# Altium schematic sheet UC3842.SchDoc (part 1 of 2)
size 1651 x 1651 mm; SheetNumber: 1; SheetTotal: 1
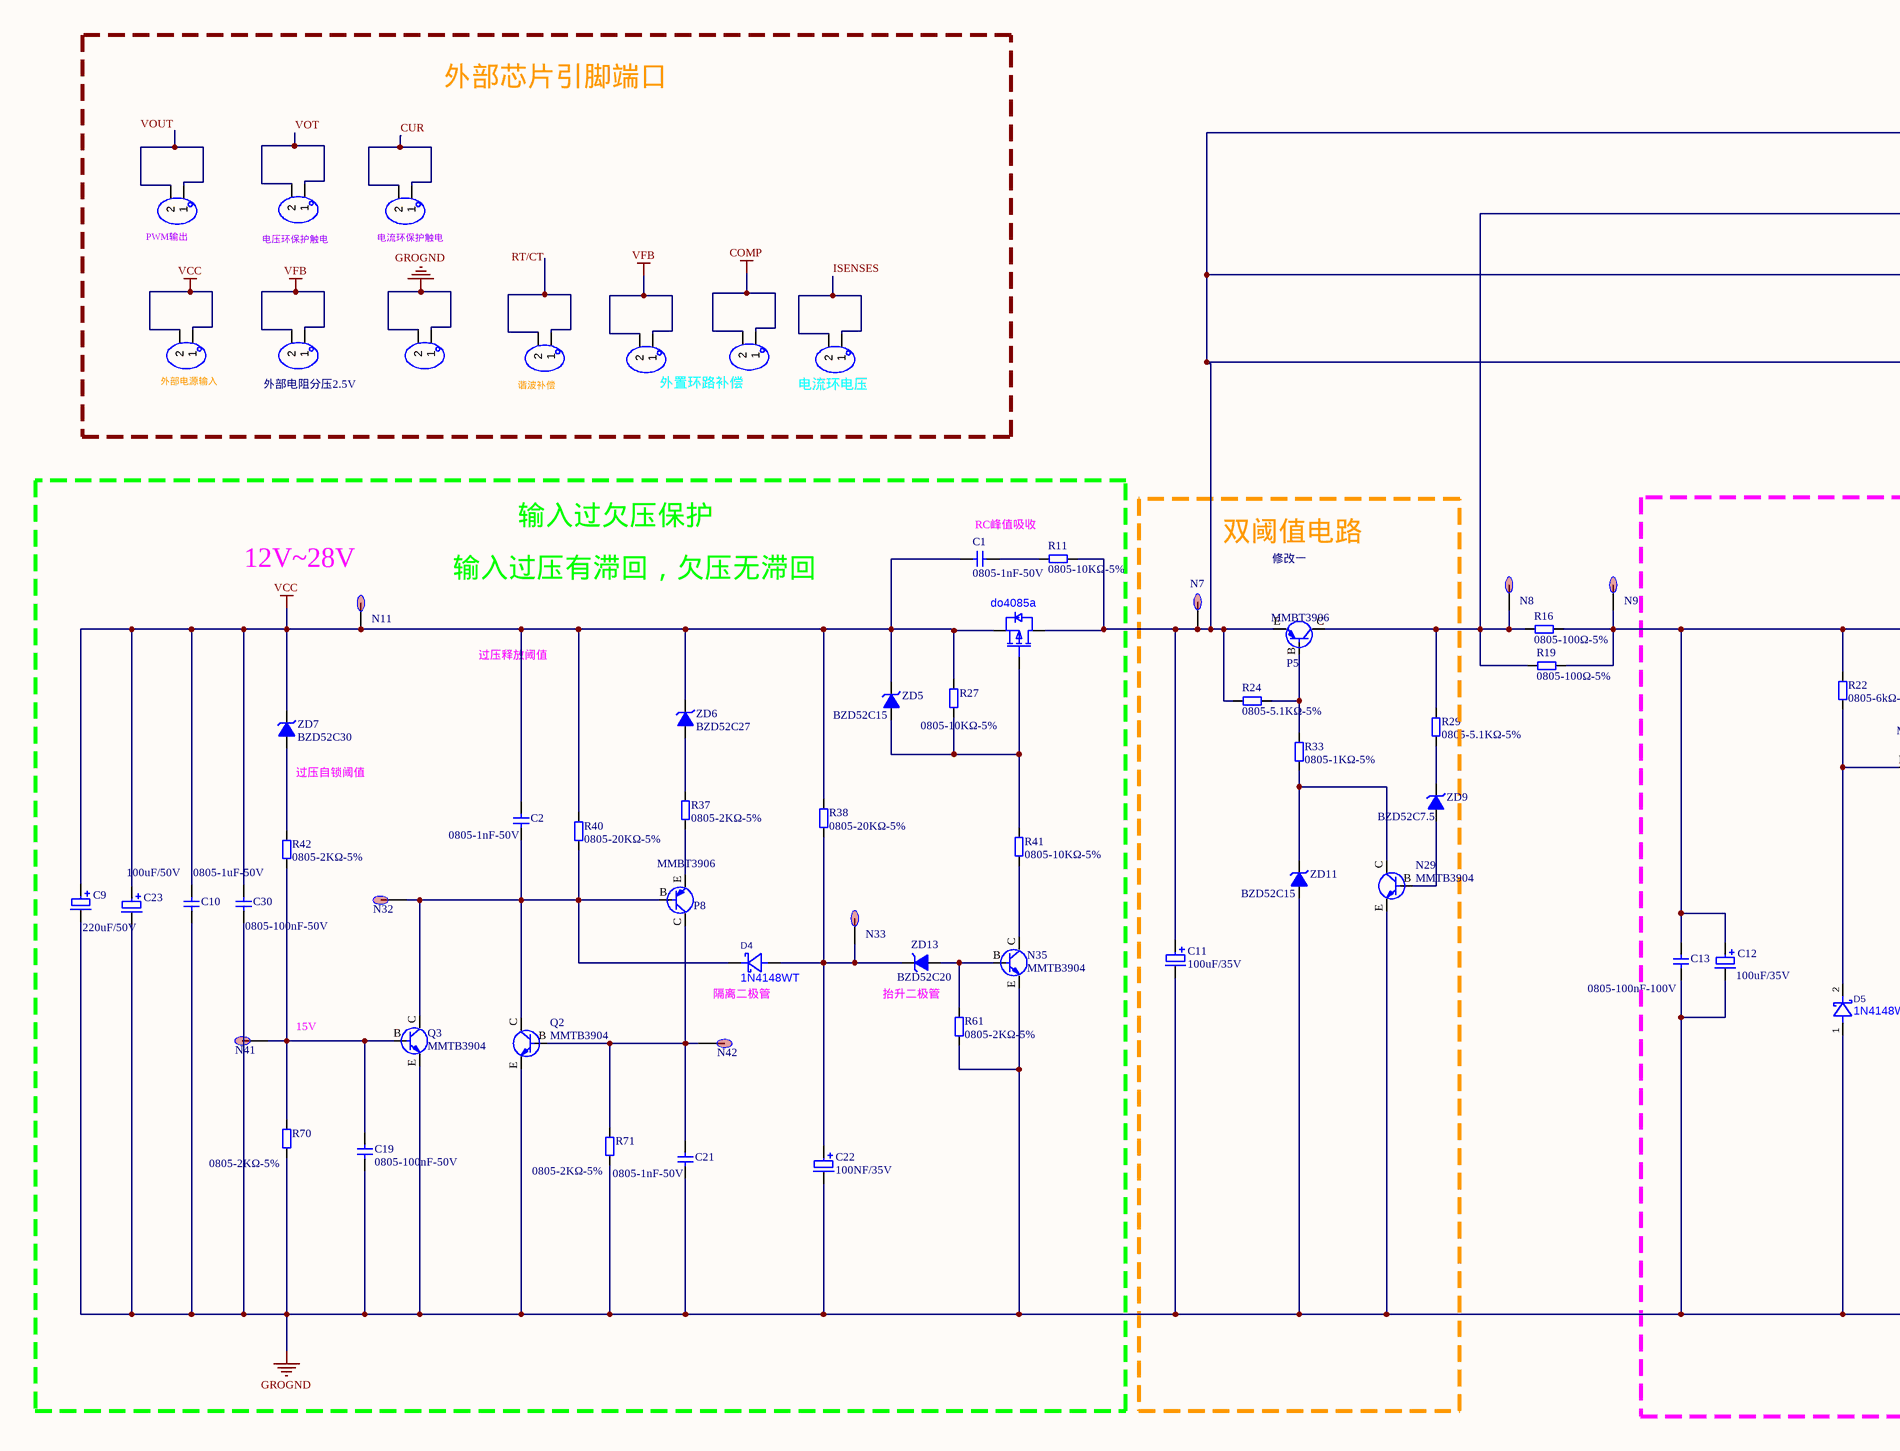
[diagram p0: UC3842.SchDoc, top column 1 of 4]
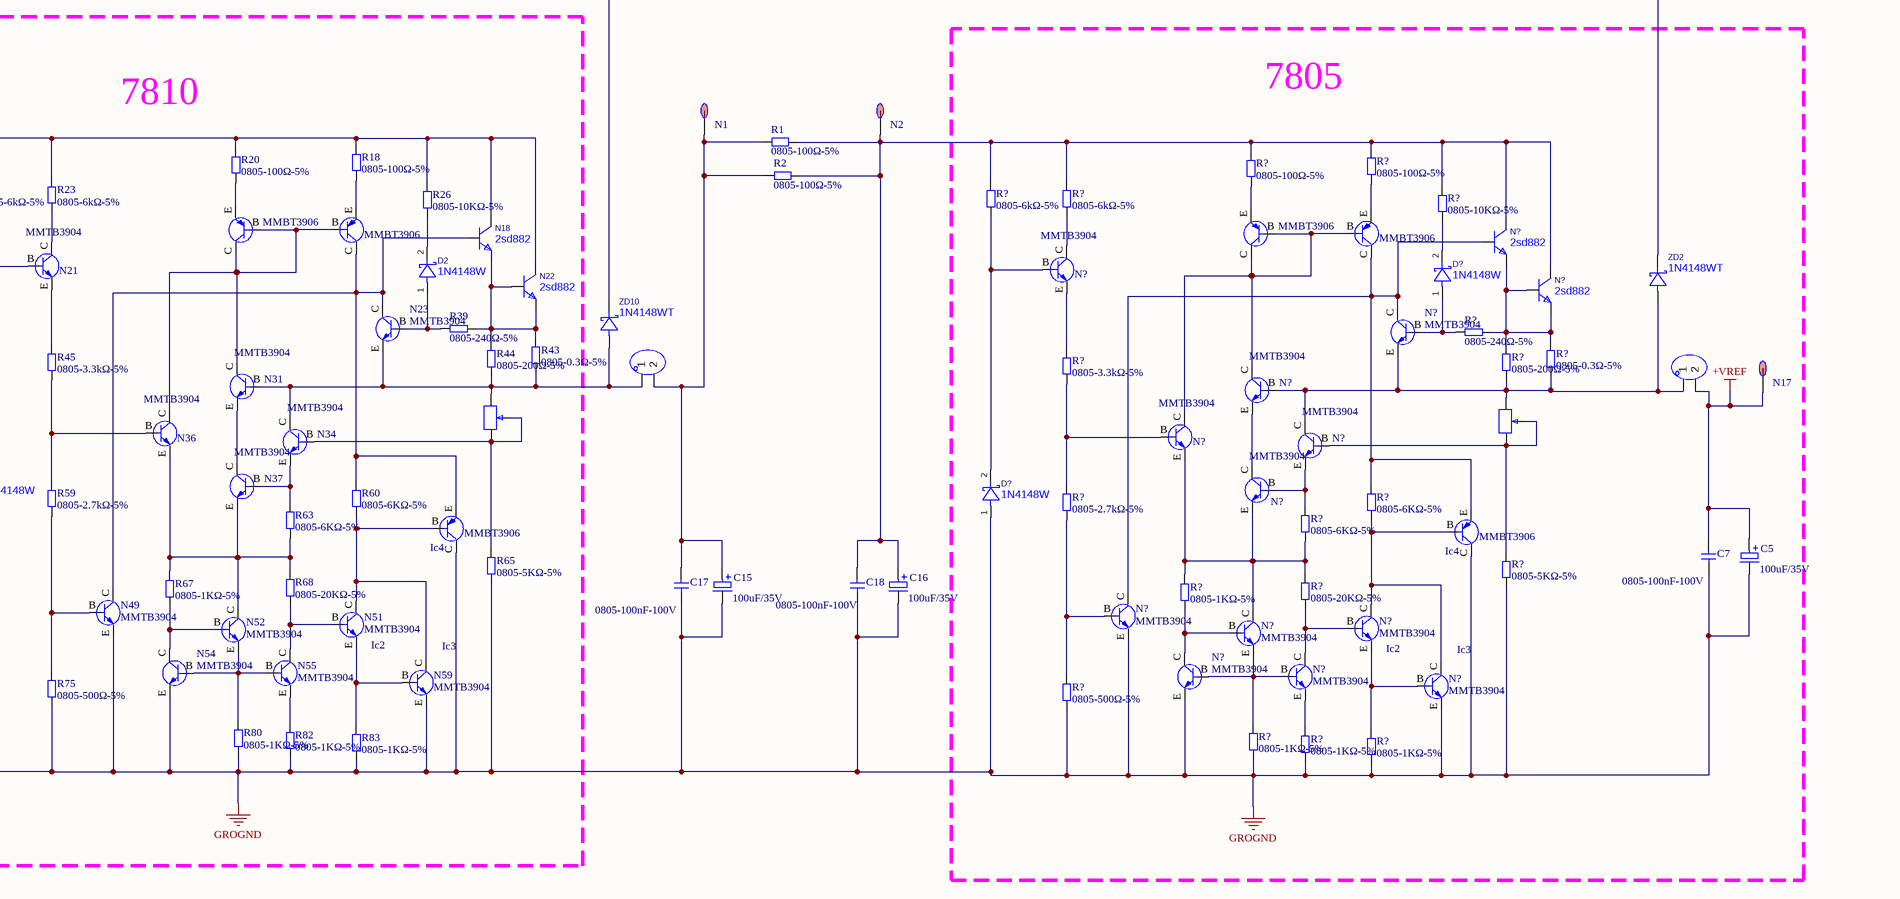
[diagram p1: UC3842.SchDoc, top column 2 of 4]
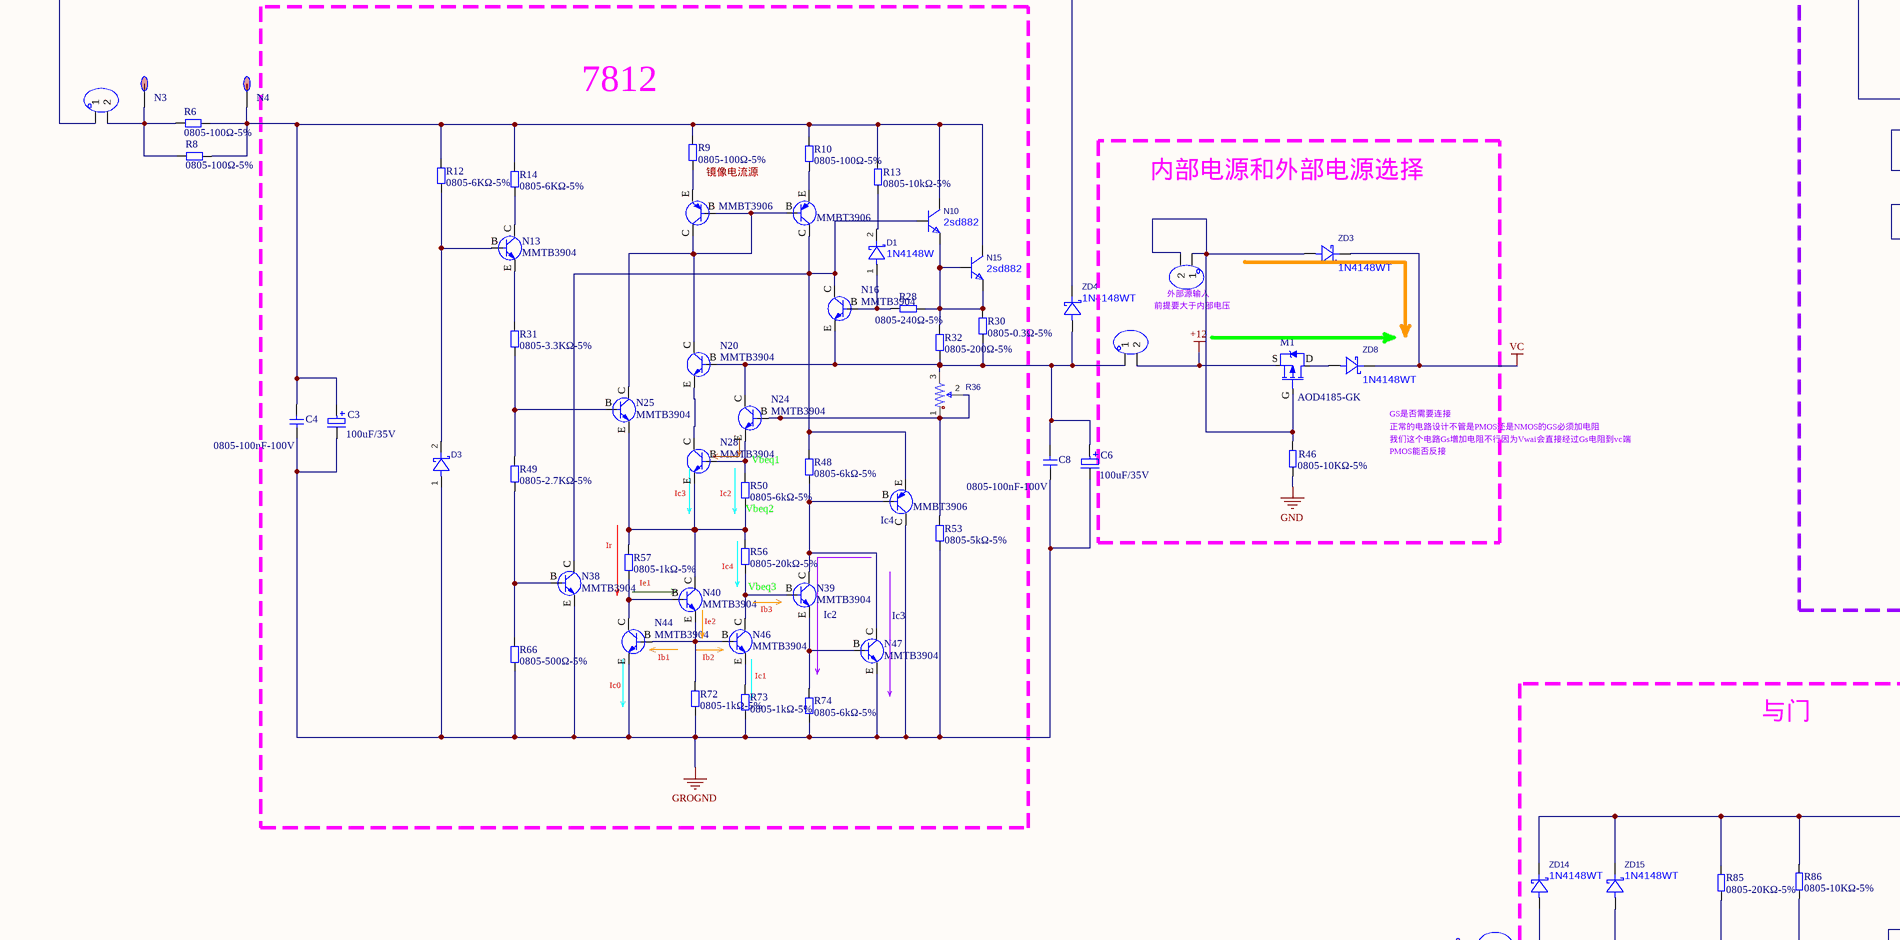
[diagram p2: UC3842.SchDoc, top column 3 of 4]
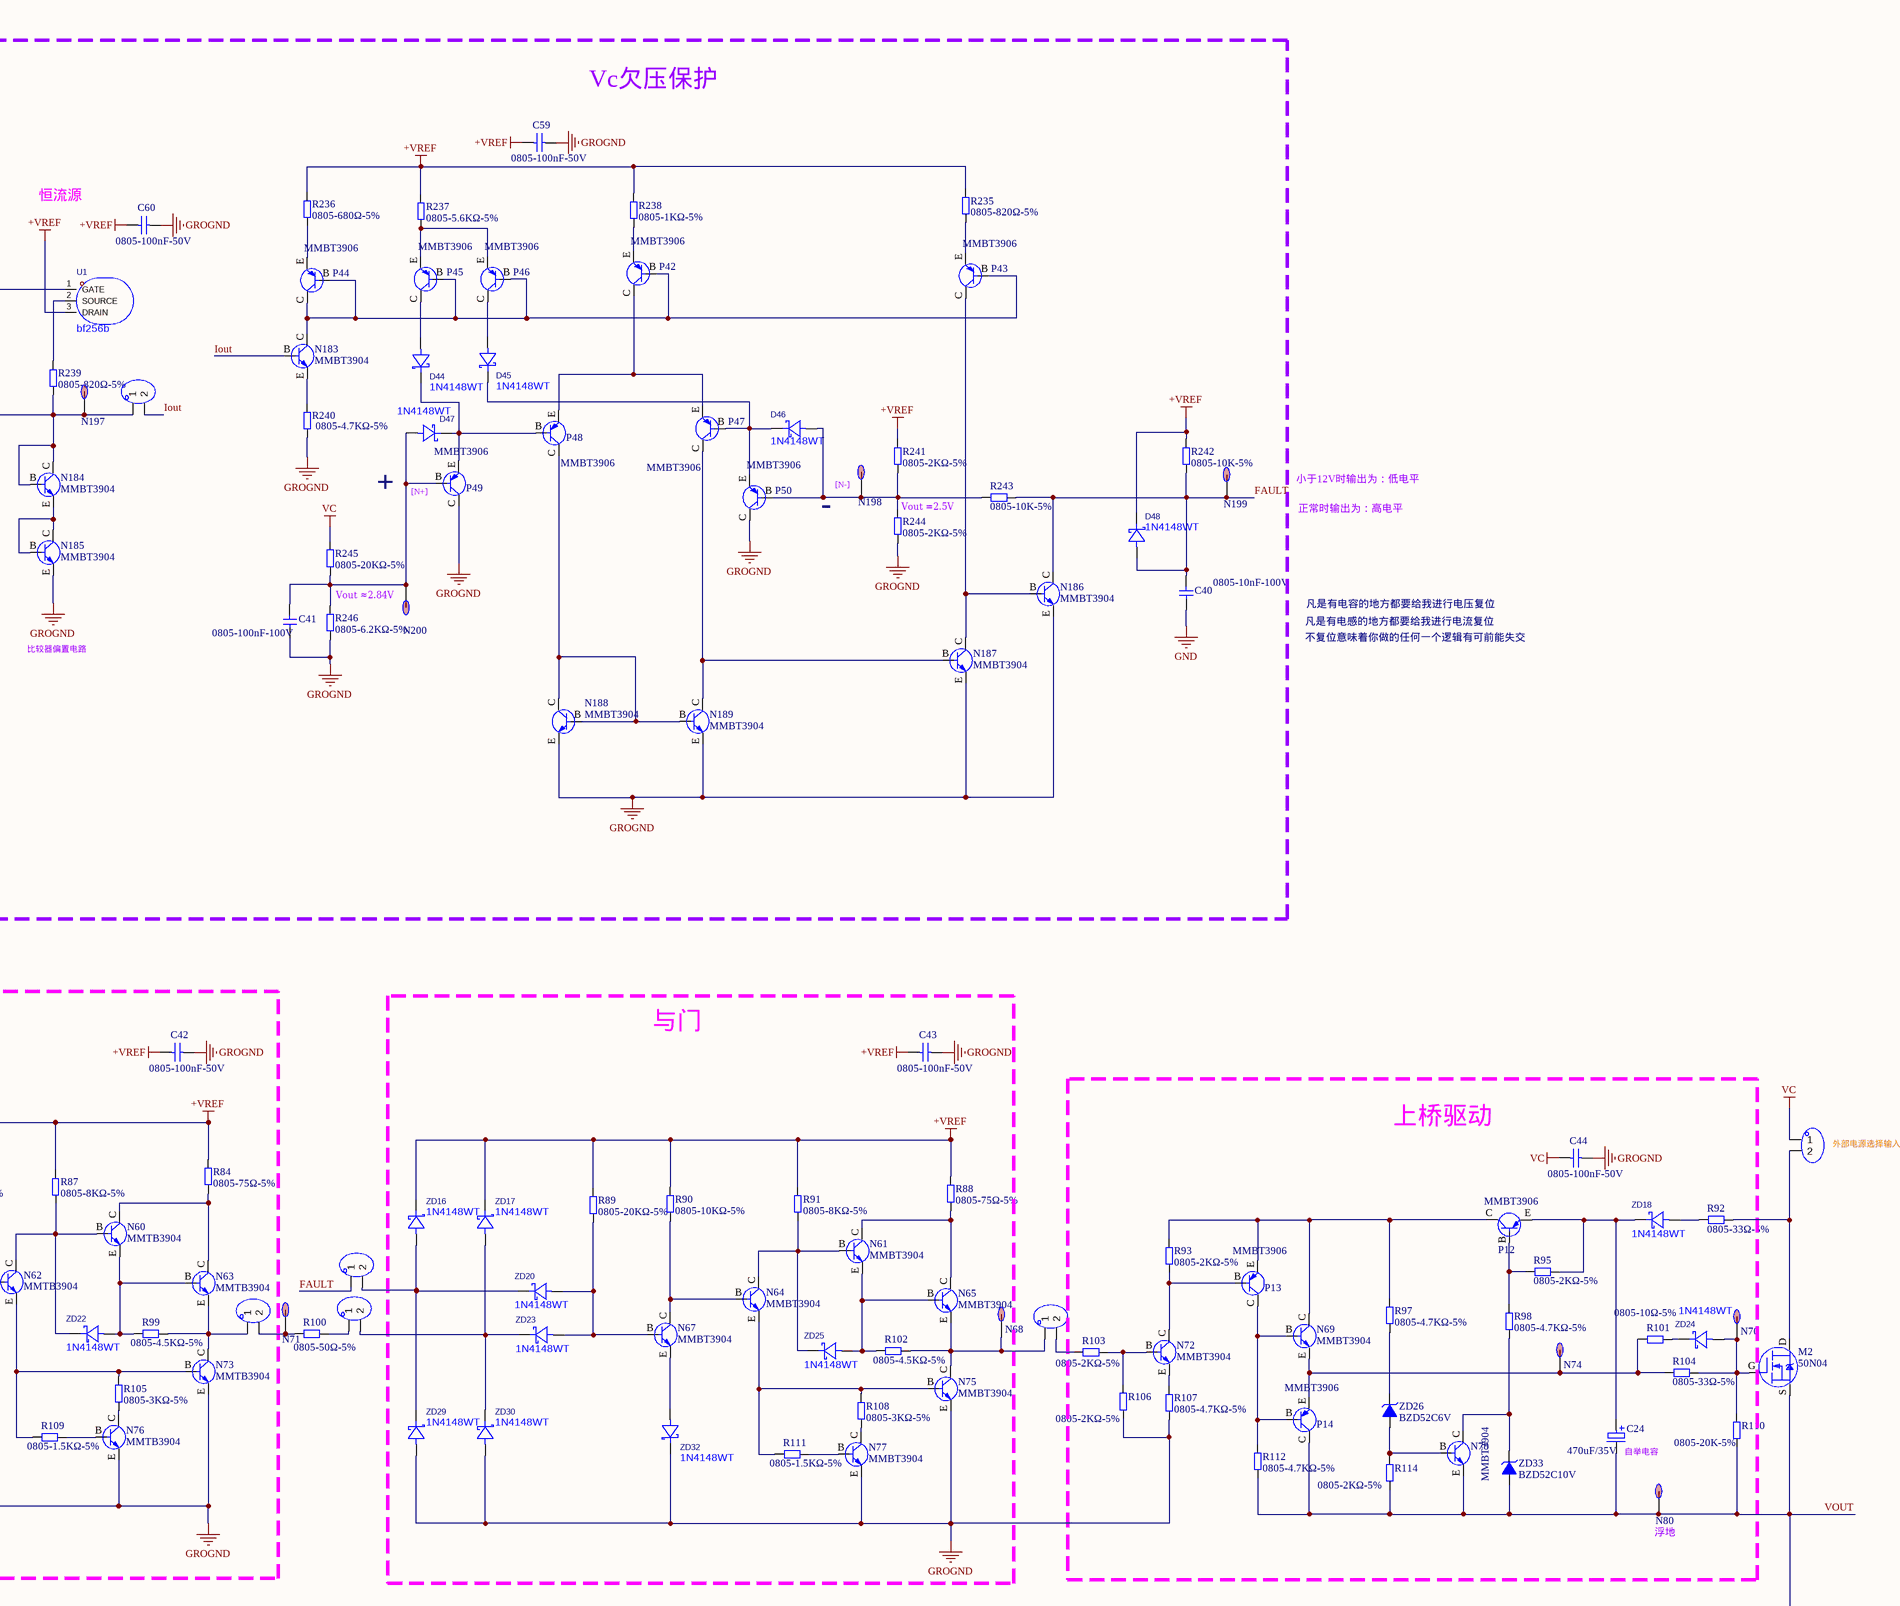
[diagram p3: UC3842.SchDoc, top column 4 of 4]
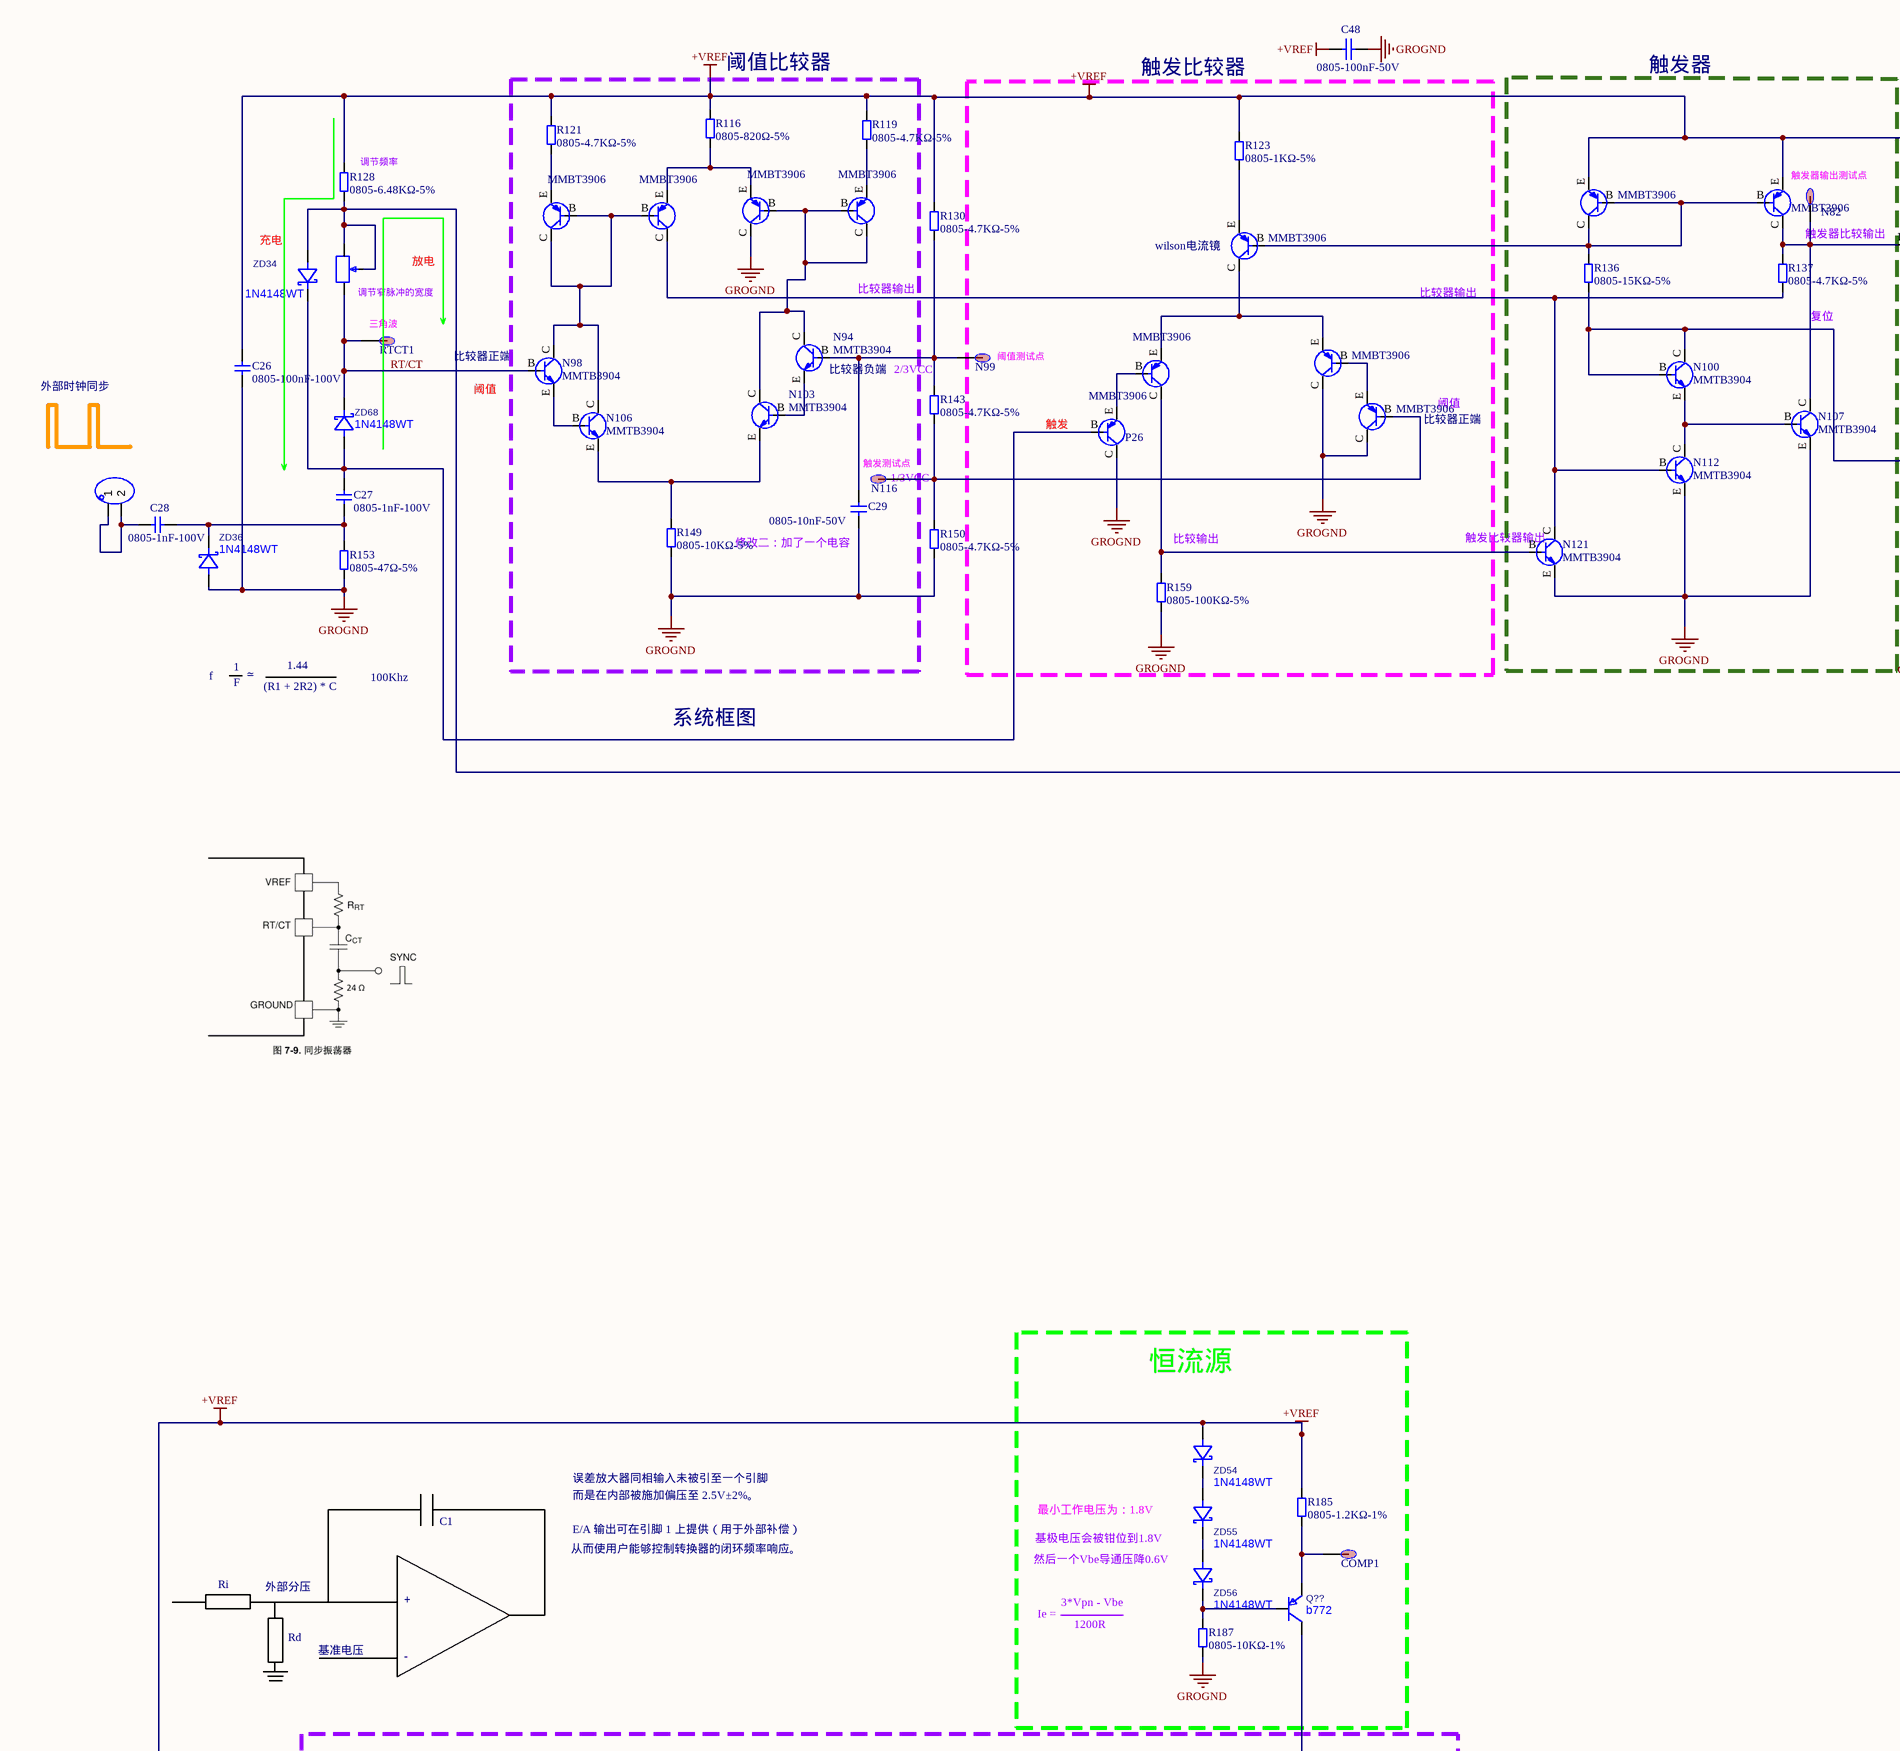
[diagram p4: UC3842.SchDoc, centre column 1 of 4]
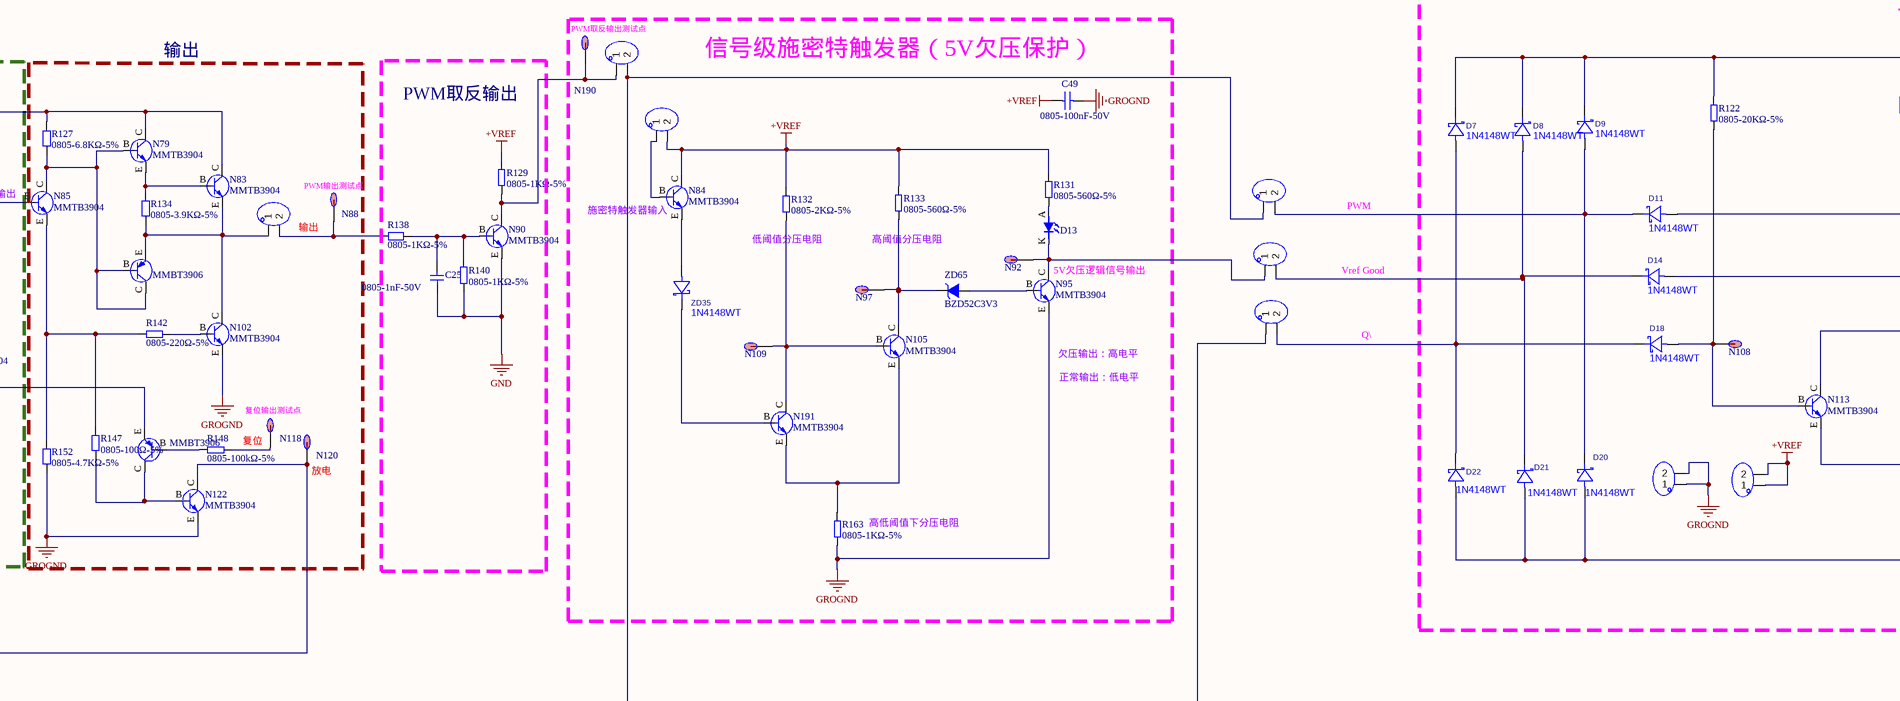
[diagram p5: UC3842.SchDoc, centre column 2 of 4]
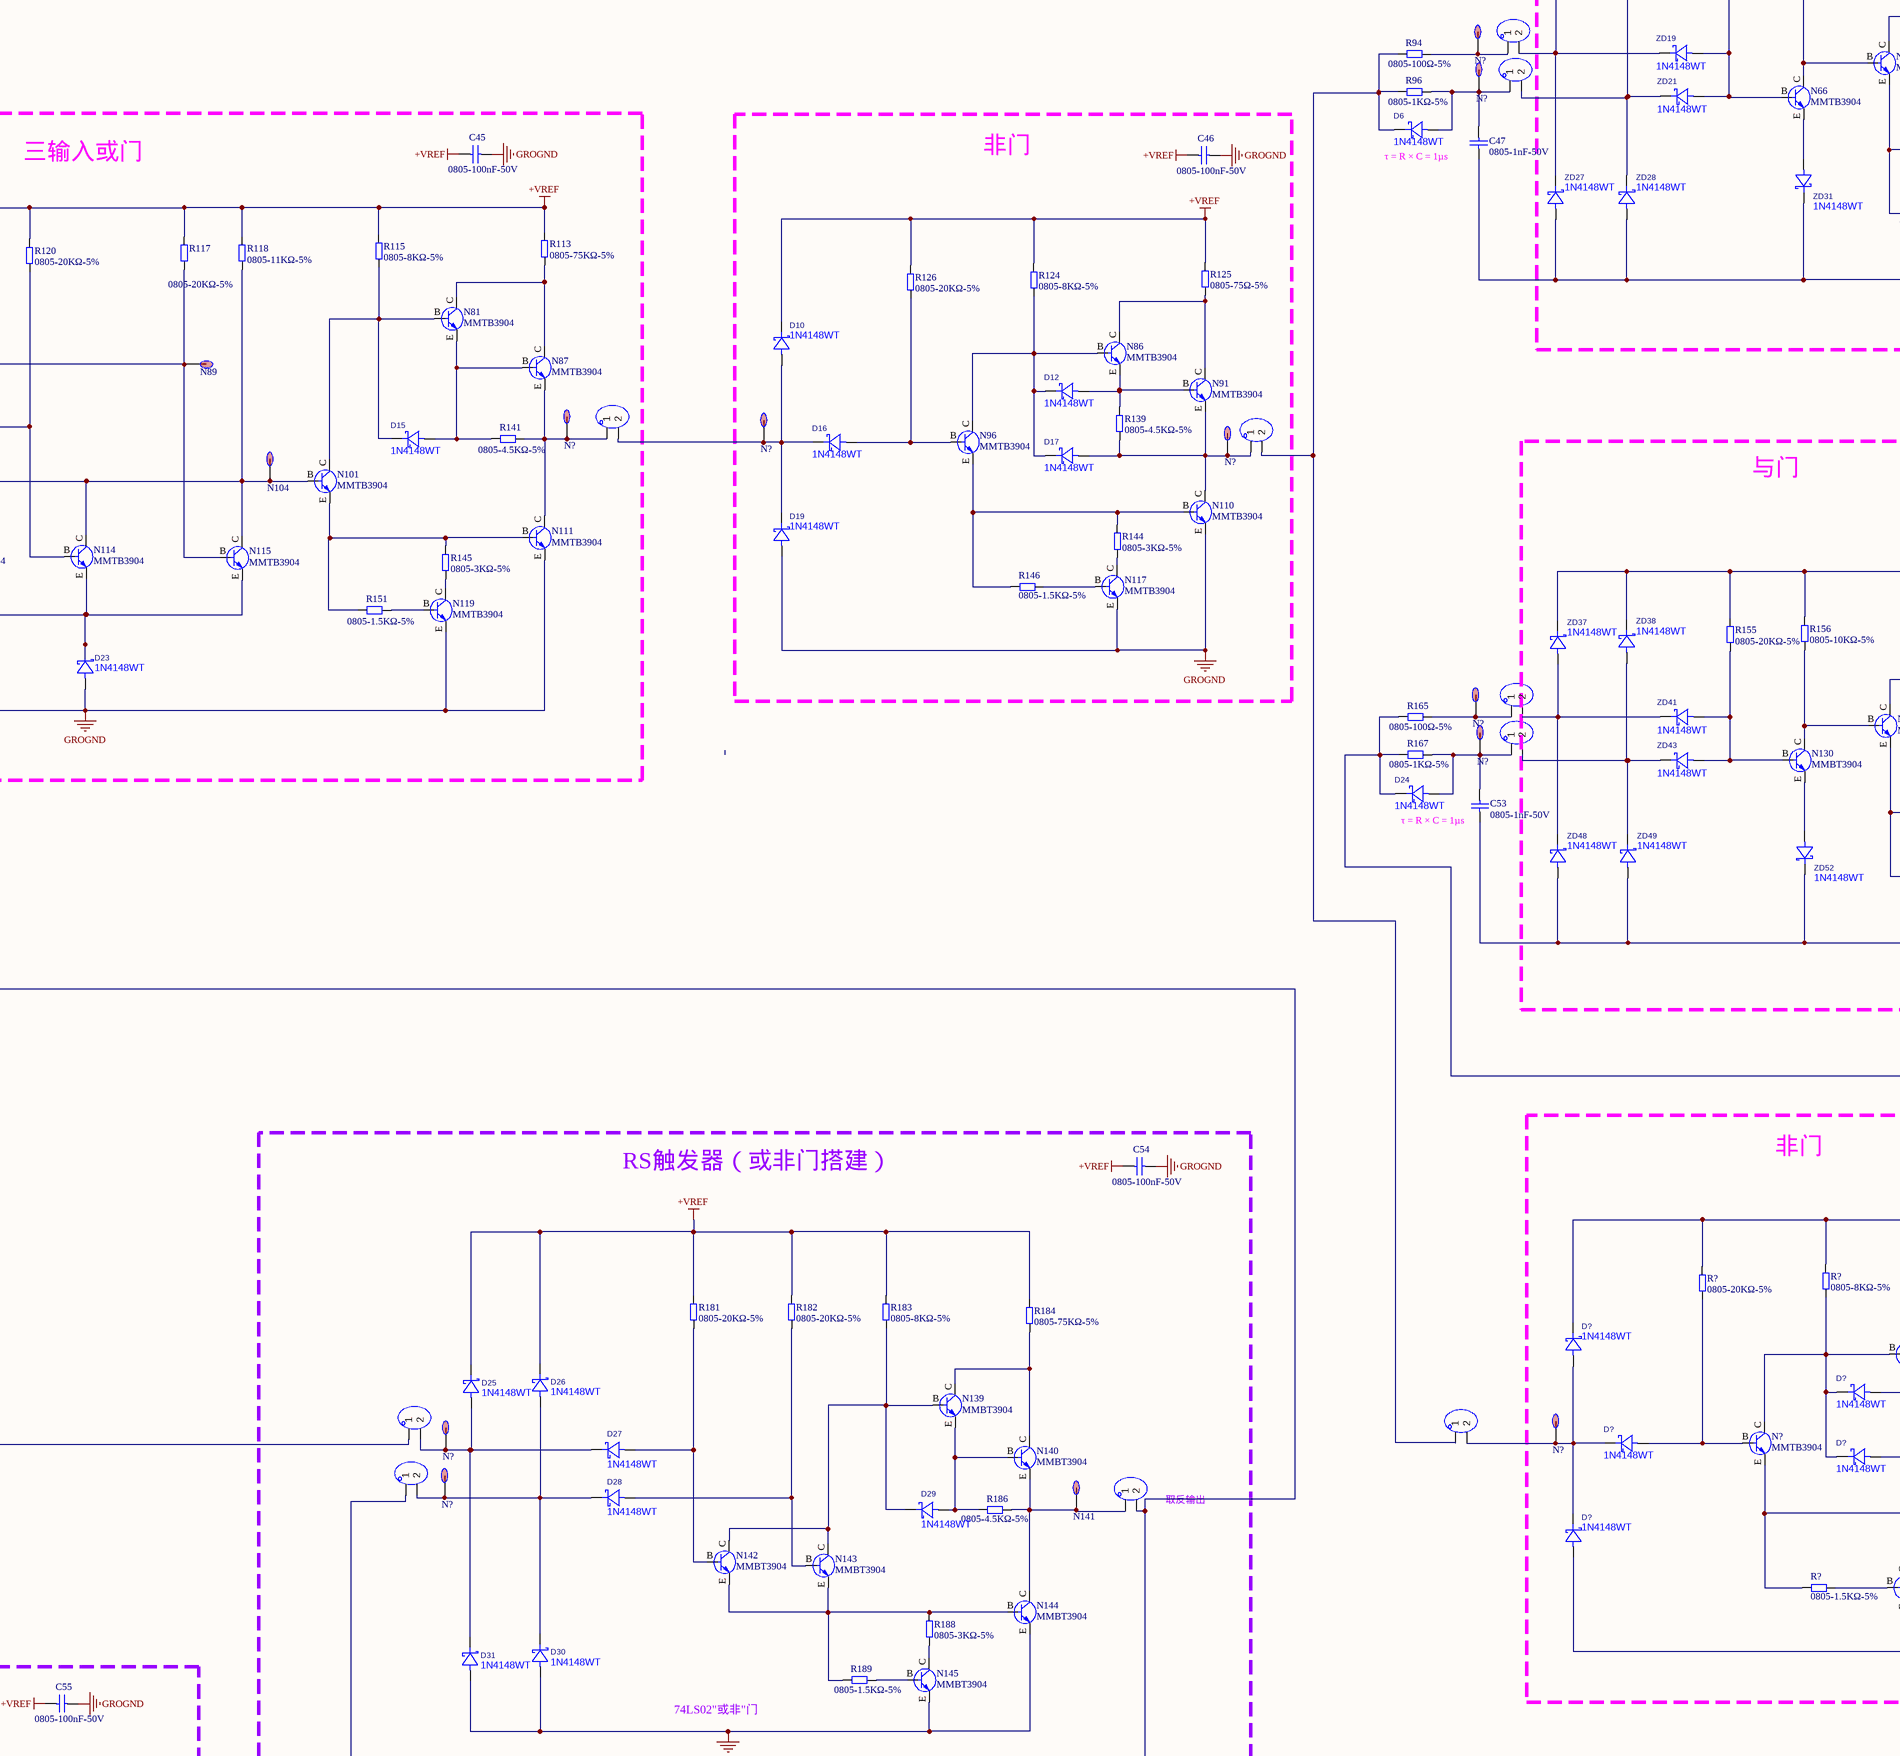
[diagram p6: UC3842.SchDoc, centre column 3 of 4]
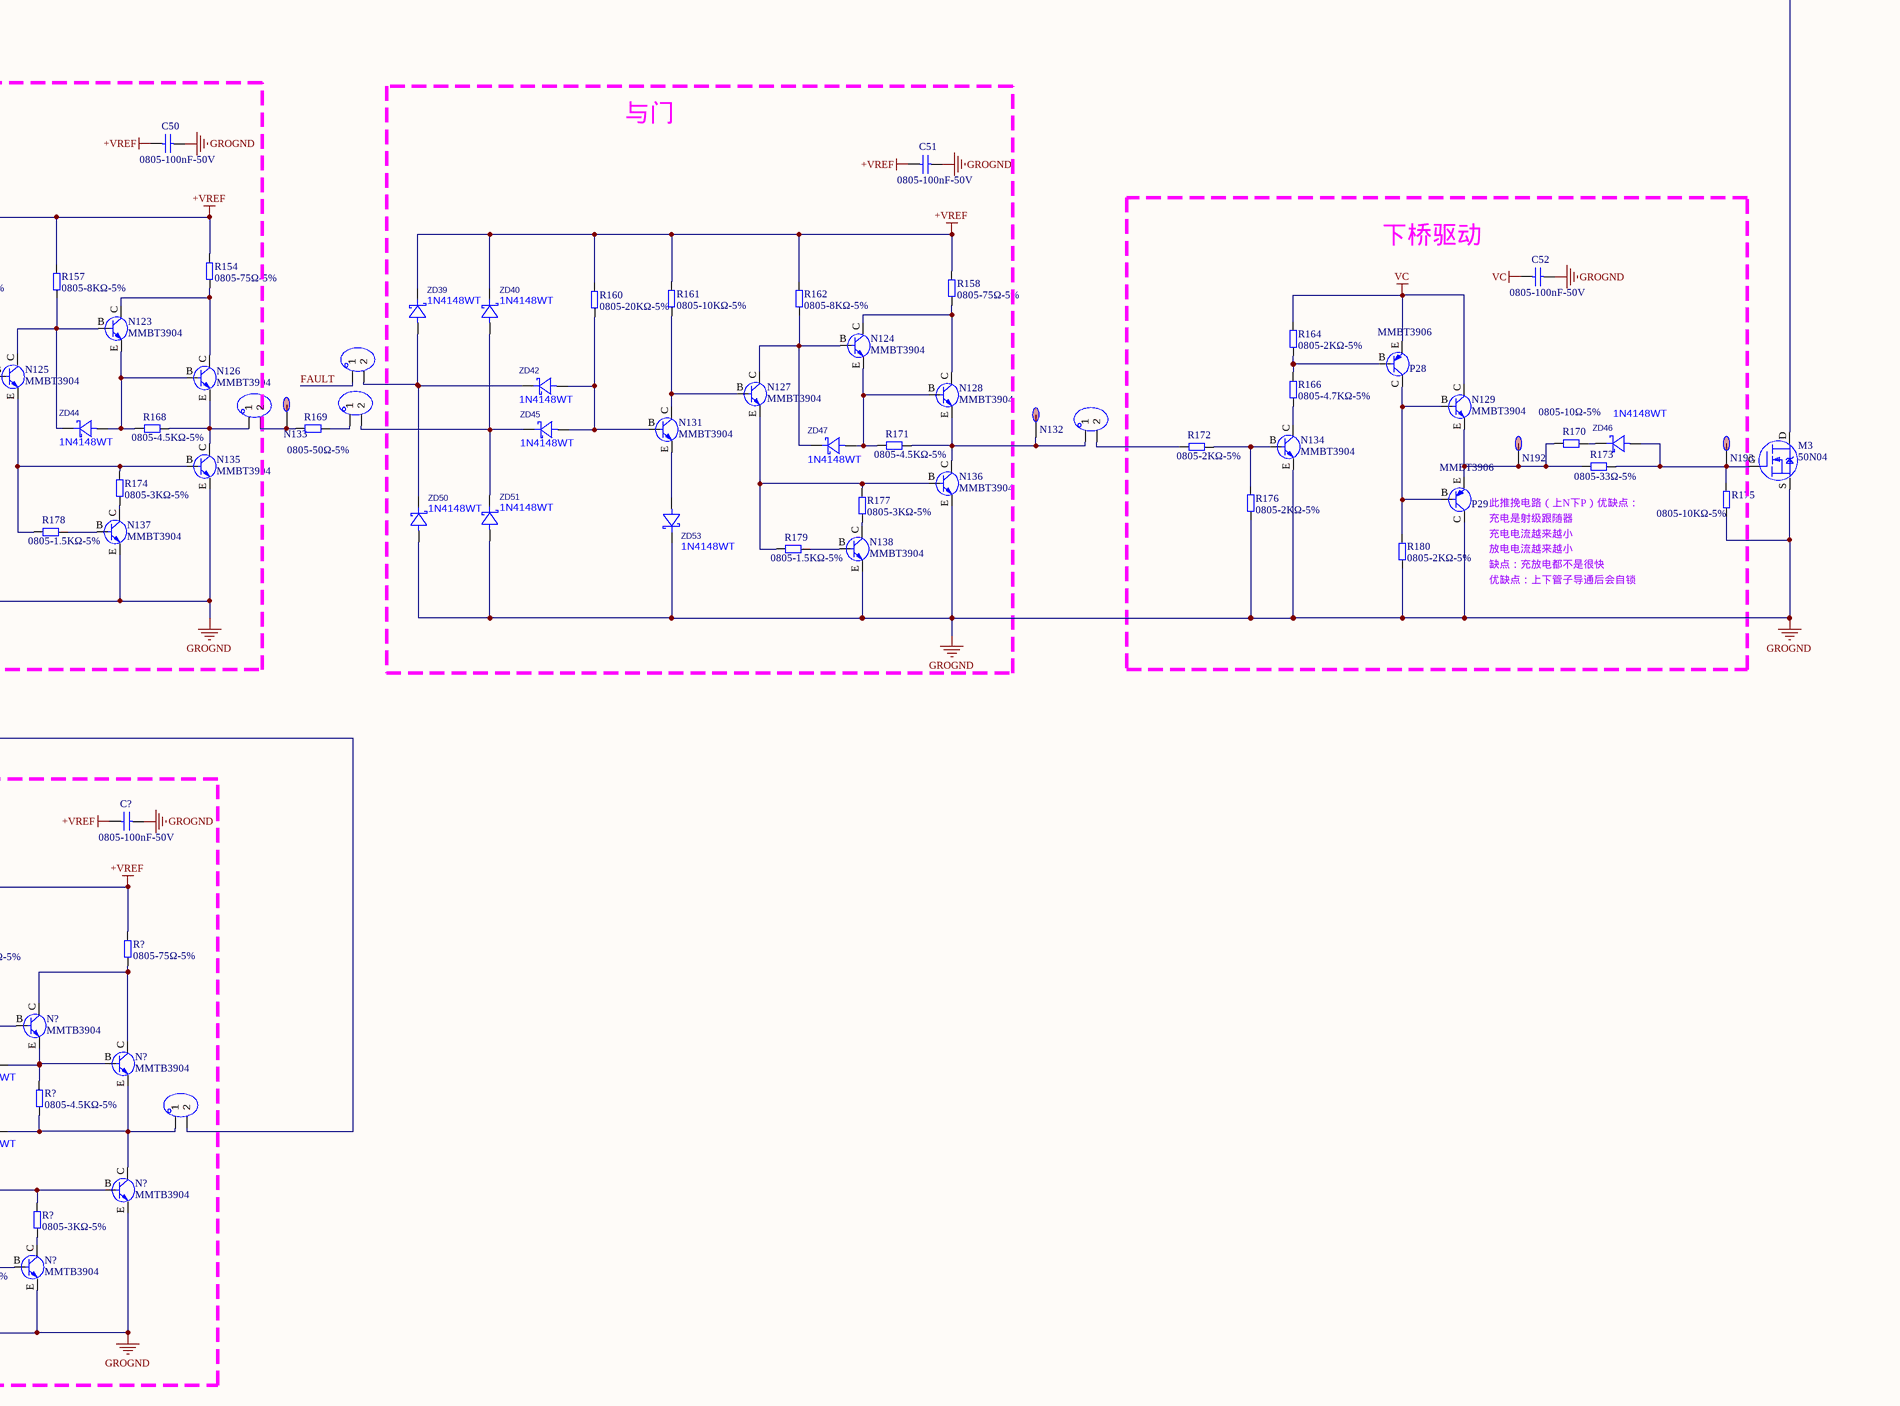
[diagram p7: UC3842.SchDoc, centre column 4 of 4]
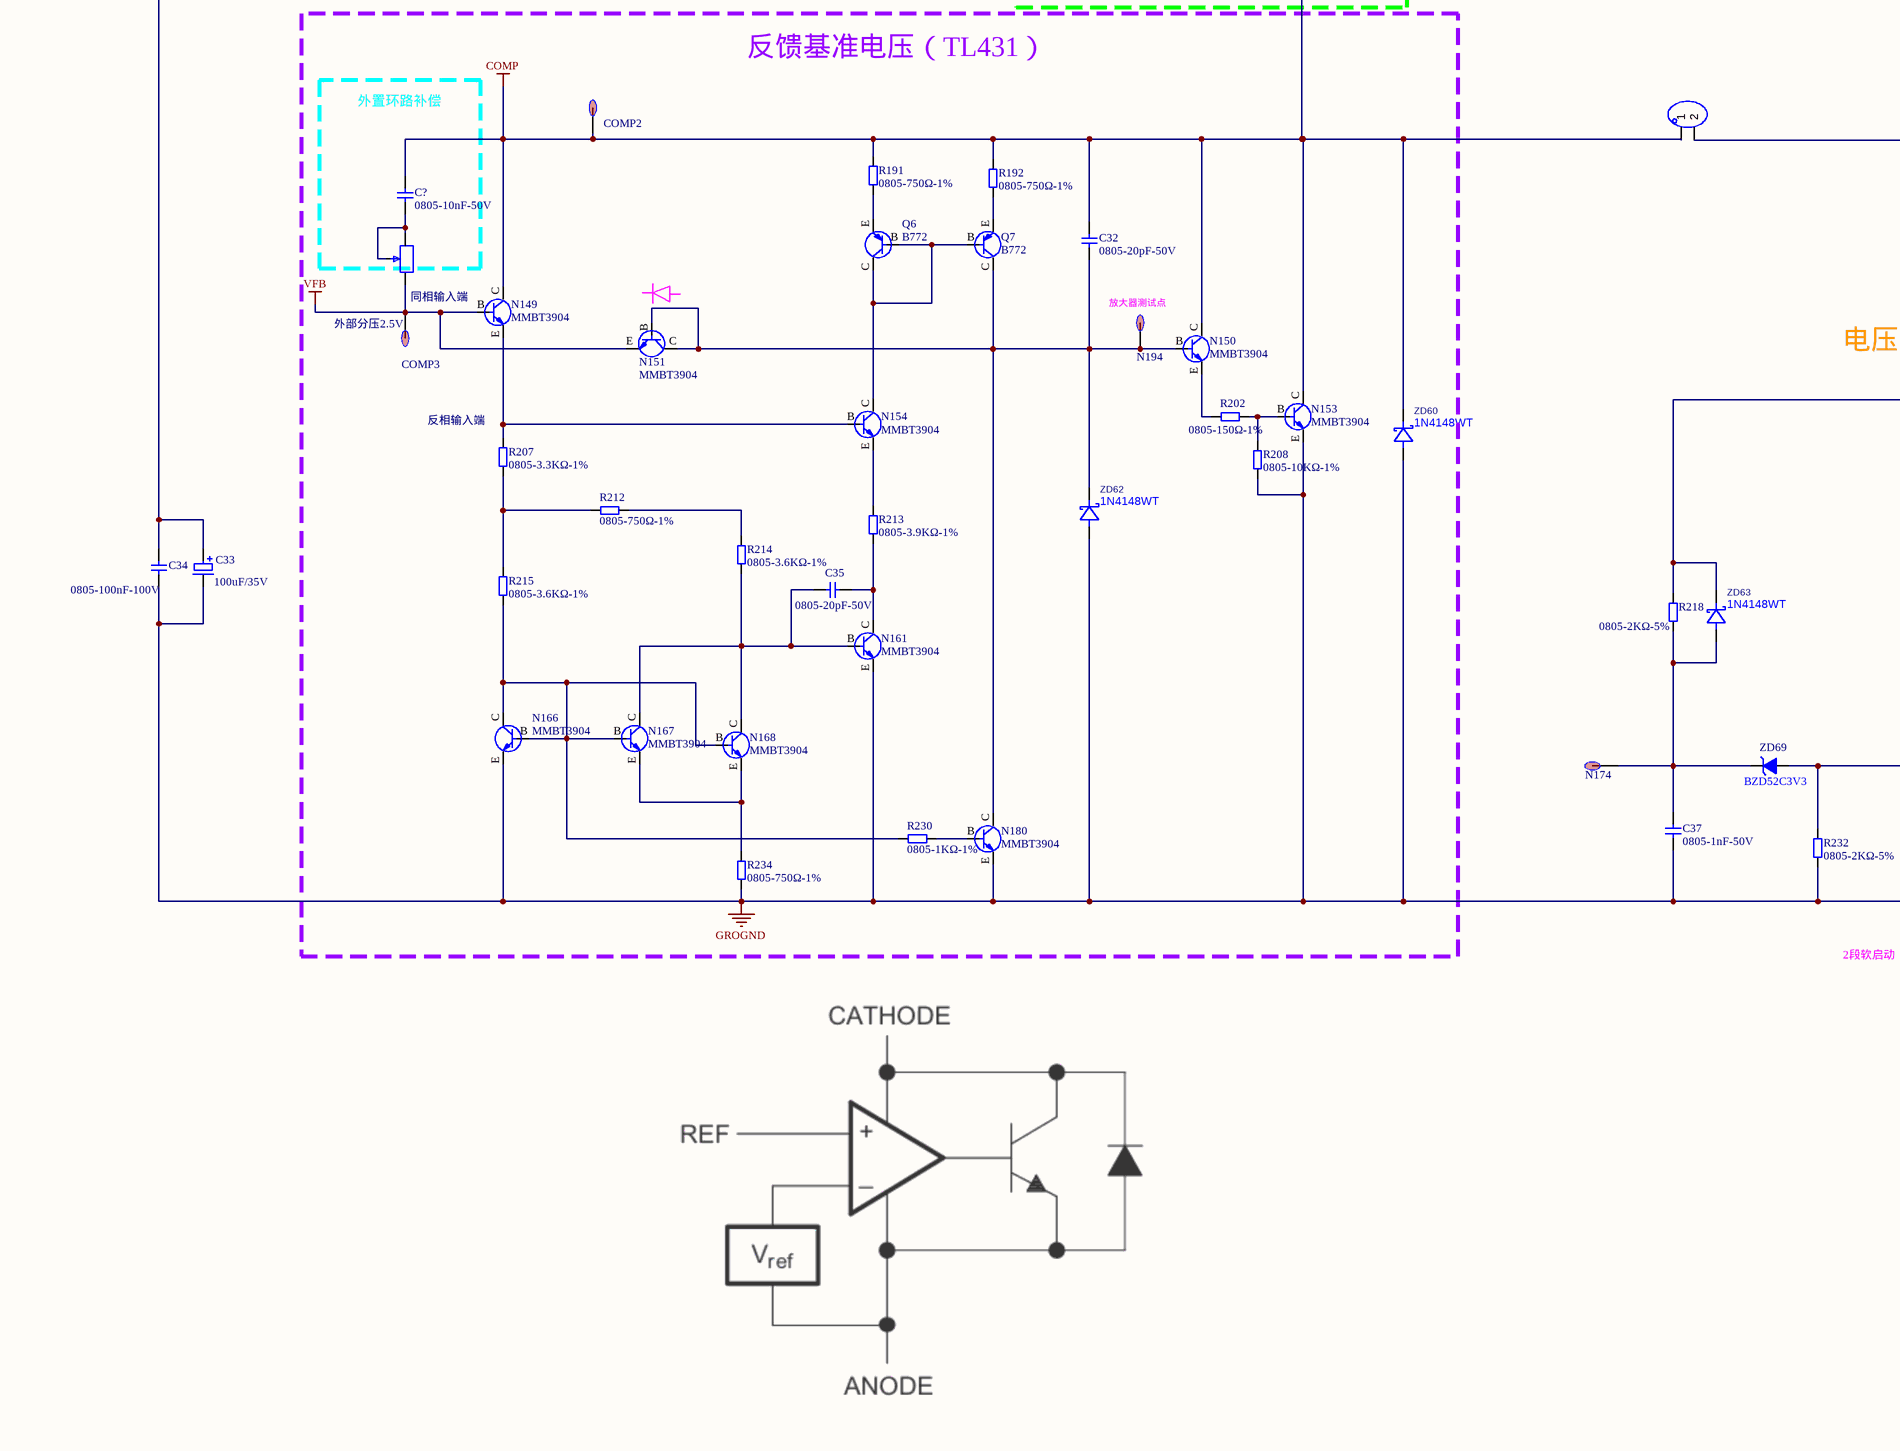
[diagram p8: UC3842.SchDoc, bottom column 1 of 4]
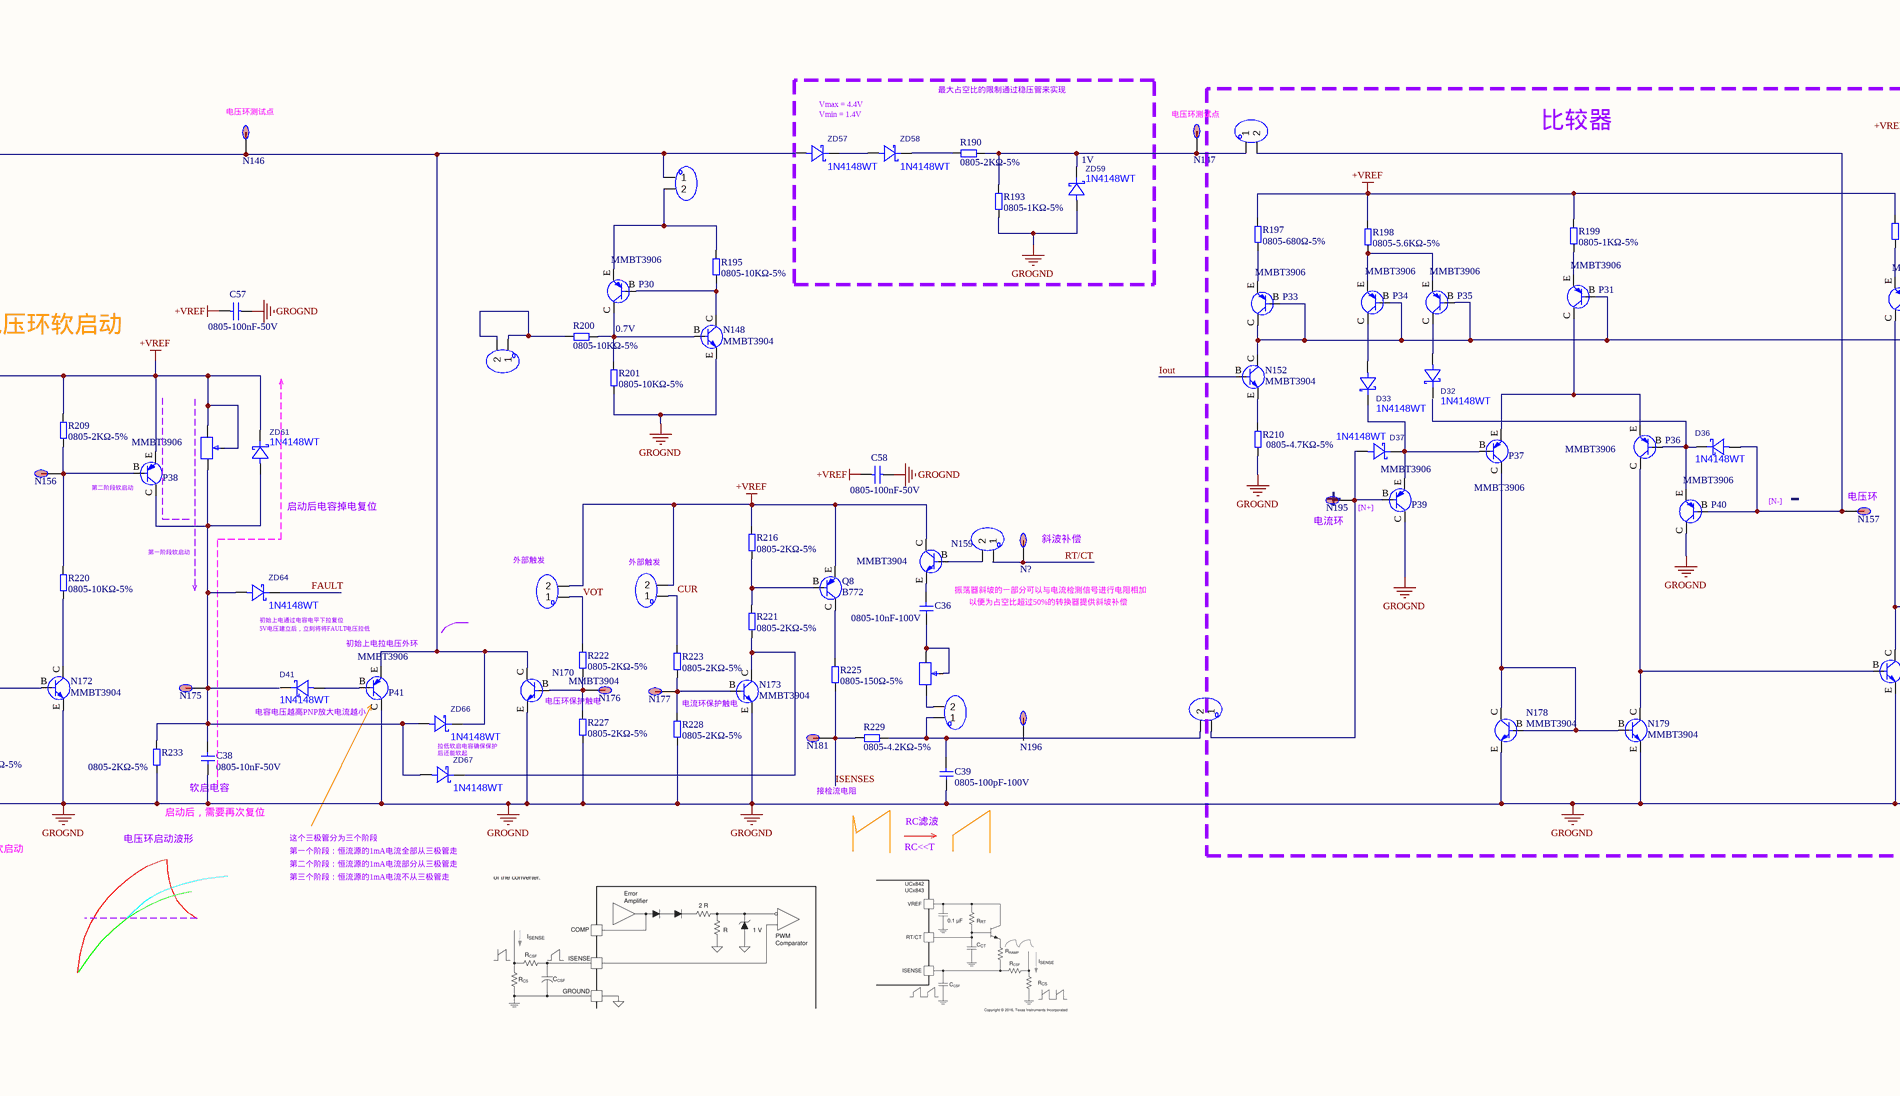
[diagram p9: UC3842.SchDoc, bottom column 2 of 4]
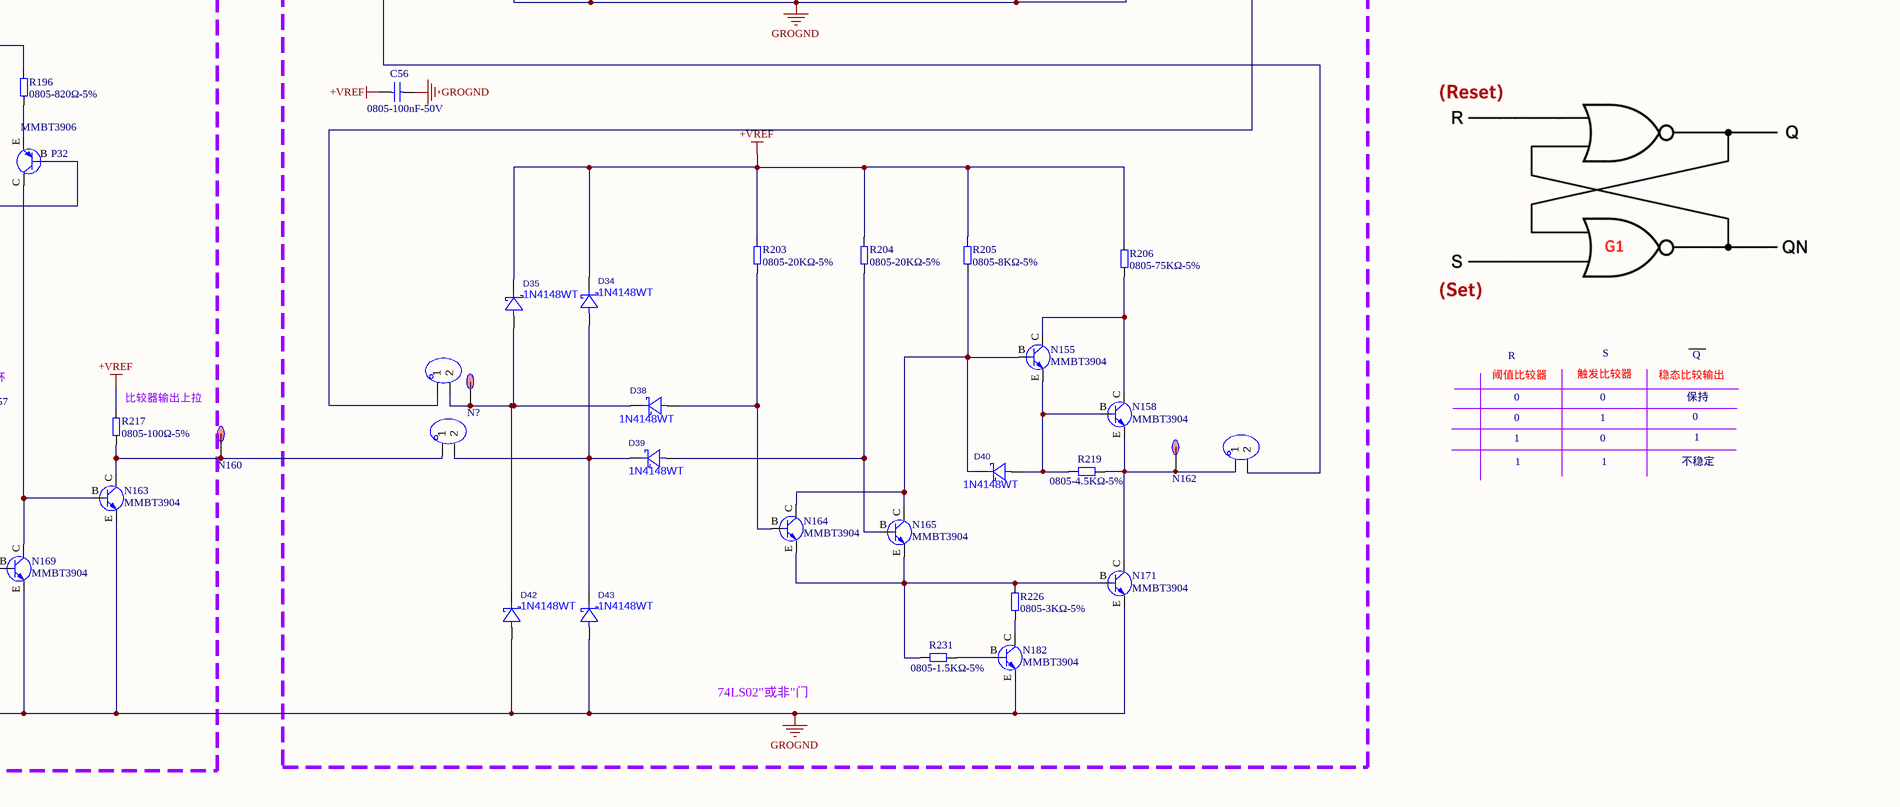
[diagram p10: UC3842.SchDoc, bottom column 3 of 4]

## Parts
(Parts that share a designator on the sheet are numbered #1, #2 ... from top to bottom, then left to right.)
C1  0805-1nF-50V  [C0603]
C2  0805-1nF-50V  [C0603]
C3  100uF/35V  [CAP-SMD_BD6.3-L6.6-W6.6-LS7.6-FD]
C4  0805-100nF-100V  [C0603]
C5  100uF/35V  [CAP-SMD_BD6.3-L6.6-W6.6-LS7.6-FD]
C6  100uF/35V  [CAP-SMD_BD6.3-L6.6-W6.6-LS7.6-FD]
C7  0805-100nF-100V  [C0603]
C8  0805-100nF-100V  [C0603]
C9  220uF/50V  [CAP-SMD_BD6.3-L6.6-W6.6-LS7.6-FD]
C10  0805-1uF-50V  [C0603]
C11  100uF/35V  [CAP-SMD_BD6.3-L6.6-W6.6-LS7.6-FD]
C12  100uF/35V  [CAP-SMD_BD6.3-L6.6-W6.6-LS7.6-FD]
C13  0805-100nF-100V  [C0603]
C15  100uF/35V  [CAP-SMD_BD6.3-L6.6-W6.6-LS7.6-FD]
C16  100uF/35V  [CAP-SMD_BD6.3-L6.6-W6.6-LS7.6-FD]
C17  0805-100nF-100V  [C0603]
C18  0805-100nF-100V  [C0603]
C19  0805-100nF-50V  [C0603]
C21  0805-1nF-50V  [C0603]
C22  100NF/35V  [CAP-SMD_BD6.3-L6.6-W6.6-LS7.6-FD]
C23  100uF/50V  [CAP-SMD_BD6.3-L6.6-W6.6-LS7.6-FD]
C24  470uF/35V  [CAP-SMD_BD6.3-L6.6-W6.6-LS7.6-FD]
C25  0805-1nF-50V  [C0603]
C26  0805-100nF-100V  [C0603]
C27  0805-1nF-100V  [C0603]
C28  0805-1nF-100V  [C0603]
C29  0805-10nF-50V  [C0603]
C30  0805-100nF-50V  [C0603]
C32  0805-20pF-50V  [C0603]
C33  100uF/35V  [CAP-SMD_BD6.3-L6.6-W6.6-LS7.6-FD]
C34  0805-100nF-100V  [C0603]
C35  0805-20pF-50V  [C0603]
C36  0805-10nF-100V  [C0603]
C37  0805-1nF-50V  [C0603]
C38  0805-10nF-50V  [C0603]
C39  0805-100pF-100V  [C0603]
C40  0805-10nF-100V  [C0603]
C41  0805-100nF-100V  [C0603]
C42  0805-100nF-50V  [C0603]
C43  0805-100nF-50V  [C0603]
C44  0805-100nF-50V  [C0603]
C45  0805-100nF-50V  [C0603]
C46  0805-100nF-50V  [C0603]
C47  0805-1nF-50V  [C0603]
C48  0805-100nF-50V  [C0603]
C49  0805-100nF-50V  [C0603]
C50  0805-100nF-50V  [C0603]
C51  0805-100nF-50V  [C0603]
C52  0805-100nF-50V  [C0603]
C53  0805-1nF-50V  [C0603]
C54  0805-100nF-50V  [C0603]
C55  0805-100nF-50V  [C0603]
C56  0805-100nF-50V  [C0603]
C57  0805-100nF-50V  [C0603]
C58  0805-100nF-50V  [C0603]
C59  0805-100nF-50V  [C0603]
C60  0805-100nF-50V  [C0603]
C?#1  0805-100nF-50V  [C0603]
C?#2  0805-10nF-50V  [C0603]
COMP1  (no value)  [TEST-TH_BD2.54-P1.4_RED]
COMP2  (no value)  [TEST-TH_BD2.54-P1.4_RED]
COMP3  (no value)  [TEST-TH_BD2.54-P1.4_RED]
D1  1N4148W
D2  1N4148W
D3  1N4148W_C7420318  (value not drawn)
D4  1N4148WT  [SOD-523_L1.2-W0.8-LS1.6-FD]
D5  1N4148W
D6  1N4148WT  [SOD-523_L1.2-W0.8-LS1.6-FD]
D7  1N4148WT  [SOD-523_L1.2-W0.8-LS1.6-FD]
D8  1N4148WT  [SOD-523_L1.2-W0.8-LS1.6-FD]
D9  1N4148WT  [SOD-523_L1.2-W0.8-LS1.6-FD]
D10  1N4148WT  [SOD-523_L1.2-W0.8-LS1.6-FD]
D11  1N4148WT  [SOD-523_L1.2-W0.8-LS1.6-FD]
D12  1N4148WT  [SOD-523_L1.2-W0.8-LS1.6-FD]
D13  DIO_LED  [LED-0805-RED]  (value not drawn)
D14  1N4148WT  [SOD-523_L1.2-W0.8-LS1.6-FD]
D15  1N4148WT  [SOD-523_L1.2-W0.8-LS1.6-FD]
D16  1N4148WT  [SOD-523_L1.2-W0.8-LS1.6-FD]
D17  1N4148WT  [SOD-523_L1.2-W0.8-LS1.6-FD]
D18  1N4148WT  [SOD-523_L1.2-W0.8-LS1.6-FD]
D19  1N4148WT  [SOD-523_L1.2-W0.8-LS1.6-FD]
D20  1N4148WT  [SOD-523_L1.2-W0.8-LS1.6-FD]
D21  1N4148WT  [SOD-523_L1.2-W0.8-LS1.6-FD]
D22  1N4148WT  [SOD-523_L1.2-W0.8-LS1.6-FD]
D23  1N4148WT  [SOD-523_L1.2-W0.8-LS1.6-FD]
D24  1N4148WT  [SOD-523_L1.2-W0.8-LS1.6-FD]
D25  1N4148WT  [SOD-523_L1.2-W0.8-LS1.6-FD]
D26  1N4148WT  [SOD-523_L1.2-W0.8-LS1.6-FD]
D27  1N4148WT  [SOD-523_L1.2-W0.8-LS1.6-FD]
D28  1N4148WT  [SOD-523_L1.2-W0.8-LS1.6-FD]
D29  1N4148WT  [SOD-523_L1.2-W0.8-LS1.6-FD]
D30  1N4148WT  [SOD-523_L1.2-W0.8-LS1.6-FD]
D31  1N4148WT  [SOD-523_L1.2-W0.8-LS1.6-FD]
D32  1N4148WT  [SOD-523_L1.2-W0.8-LS1.6-FD]
D33  1N4148WT  [SOD-523_L1.2-W0.8-LS1.6-FD]
D34  1N4148WT  [SOD-523_L1.2-W0.8-LS1.6-FD]
D35  1N4148WT  [SOD-523_L1.2-W0.8-LS1.6-FD]
D36  1N4148WT  [SOD-523_L1.2-W0.8-LS1.6-FD]
D37  1N4148WT  [SOD-523_L1.2-W0.8-LS1.6-FD]
D38  1N4148WT  [SOD-523_L1.2-W0.8-LS1.6-FD]
D39  1N4148WT  [SOD-523_L1.2-W0.8-LS1.6-FD]
D40  1N4148WT  [SOD-523_L1.2-W0.8-LS1.6-FD]
D41  1N4148WT  [SOD-523_L1.2-W0.8-LS1.6-FD]
D42  1N4148WT  [SOD-523_L1.2-W0.8-LS1.6-FD]
D43  1N4148WT  [SOD-523_L1.2-W0.8-LS1.6-FD]
D44  1N4148WT  [SOD-523_L1.2-W0.8-LS1.6-FD]
D45  1N4148WT  [SOD-523_L1.2-W0.8-LS1.6-FD]
D46  1N4148WT  [SOD-523_L1.2-W0.8-LS1.6-FD]
D47  1N4148WT  [SOD-523_L1.2-W0.8-LS1.6-FD]
D48  1N4148WT  [SOD-523_L1.2-W0.8-LS1.6-FD]
D?#1  1N4148W
D?#2  1N4148W
D?#3  1N4148WT  [SOD-523_L1.2-W0.8-LS1.6-FD]
D?#4  1N4148WT  [SOD-523_L1.2-W0.8-LS1.6-FD]
D?#5  1N4148WT  [SOD-523_L1.2-W0.8-LS1.6-FD]
D?#6  1N4148WT  [SOD-523_L1.2-W0.8-LS1.6-FD]
D?#7  1N4148WT  [SOD-523_L1.2-W0.8-LS1.6-FD]
H1  pz254v-11-02p  [HDR-TH_2P-P2.54-V-M]  (value not drawn)
H2  pz254v-11-02p  [HDR-TH_2P-P2.54-V-M]  (value not drawn)
H3  pz254v-11-02p  [HDR-TH_2P-P2.54-V-M]  (value not drawn)
H4  pz254v-11-02p  [HDR-TH_2P-P2.54-V-M]  (value not drawn)
H5  pz254v-11-02p  [HDR-TH_2P-P2.54-V-M]  (value not drawn)
H6  pz254v-11-02p  [HDR-TH_2P-P2.54-V-M]  (value not drawn)
H7  pz254v-11-02p  [HDR-TH_2P-P2.54-V-M]  (value not drawn)
H8  pz254v-11-02p  [HDR-TH_2P-P2.54-V-M]  (value not drawn)
H9  pz254v-11-02p  [HDR-TH_2P-P2.54-V-M]  (value not drawn)
H10  pz254v-11-02p  [HDR-TH_2P-P2.54-V-M]  (value not drawn)
H11  pz254v-11-02p  [HDR-TH_2P-P2.54-V-M]  (value not drawn)
H12  pz254v-11-02p  [HDR-TH_2P-P2.54-V-M]  (value not drawn)
H14  pz254v-11-02p  [HDR-TH_2P-P2.54-V-M]  (value not drawn)
H15  pz254v-11-02p  [HDR-TH_2P-P2.54-V-M]  (value not drawn)
H16  pz254v-11-02p  [HDR-TH_2P-P2.54-V-M]  (value not drawn)
H17  pz254v-11-02p  [HDR-TH_2P-P2.54-V-M]  (value not drawn)
H19  pz254v-11-02p  [HDR-TH_2P-P2.54-V-M]  (value not drawn)
H20  pz254v-11-02p  [HDR-TH_2P-P2.54-V-M]  (value not drawn)
H21  pz254v-11-02p  [HDR-TH_2P-P2.54-V-M]  (value not drawn)
H22  pz254v-11-02p  [HDR-TH_2P-P2.54-V-M]  (value not drawn)
H23  pz254v-11-02p  [HDR-TH_2P-P2.54-V-M]  (value not drawn)
H25  pz254v-11-02p  [HDR-TH_2P-P2.54-V-M]  (value not drawn)
H26  pz254v-11-02p  [HDR-TH_2P-P2.54-V-M]  (value not drawn)
H27  pz254v-11-02p  [HDR-TH_2P-P2.54-V-M]  (value not drawn)
H28  pz254v-11-02p  [HDR-TH_2P-P2.54-V-M]  (value not drawn)
H29  pz254v-11-02p  [HDR-TH_2P-P2.54-V-M]  (value not drawn)
H30  pz254v-11-02p  [HDR-TH_2P-P2.54-V-M]  (value not drawn)
H31  pz254v-11-02p  [HDR-TH_2P-P2.54-V-M]  (value not drawn)
H32  pz254v-11-02p  [HDR-TH_2P-P2.54-V-M]  (value not drawn)
H33  pz254v-11-02p  [HDR-TH_2P-P2.54-V-M]  (value not drawn)
H34  pz254v-11-02p  [HDR-TH_2P-P2.54-V-M]  (value not drawn)
H35  pz254v-11-02p  [HDR-TH_2P-P2.54-V-M]  (value not drawn)
H36  pz254v-11-02p  [HDR-TH_2P-P2.54-V-M]  (value not drawn)
H37  pz254v-11-02p  [HDR-TH_2P-P2.54-V-M]  (value not drawn)
H38  pz254v-11-02p  [HDR-TH_2P-P2.54-V-M]  (value not drawn)
H39  pz254v-11-02p  [HDR-TH_2P-P2.54-V-M]  (value not drawn)
H40  pz254v-11-02p  [HDR-TH_2P-P2.54-V-M]  (value not drawn)
H41  pz254v-11-02p  [HDR-TH_2P-P2.54-V-M]  (value not drawn)
H42  pz254v-11-02p  [HDR-TH_2P-P2.54-V-M]  (value not drawn)
H43  pz254v-11-02p  [HDR-TH_2P-P2.54-V-M]  (value not drawn)
H44  pz254v-11-02p  [HDR-TH_2P-P2.54-V-M]  (value not drawn)
H45  pz254v-11-02p  [HDR-TH_2P-P2.54-V-M]  (value not drawn)
H?#1  pz254v-11-02p  [HDR-TH_2P-P2.54-V-M]  (value not drawn)
H?#2  pz254v-11-02p  [HDR-TH_2P-P2.54-V-M]  (value not drawn)
H?#3  pz254v-11-02p  [HDR-TH_2P-P2.54-V-M]  (value not drawn)
H?#4  pz254v-11-02p  [HDR-TH_2P-P2.54-V-M]  (value not drawn)
H?#5  pz254v-11-02p  [HDR-TH_2P-P2.54-V-M]  (value not drawn)
H?#6  pz254v-11-02p  [HDR-TH_2P-P2.54-V-M]  (value not drawn)
H?#7  pz254v-11-02p  [HDR-TH_2P-P2.54-V-M]  (value not drawn)
H?#8  pz254v-11-02p  [HDR-TH_2P-P2.54-V-M]  (value not drawn)
H?#9  pz254v-11-02p  [HDR-TH_2P-P2.54-V-M]  (value not drawn)
H?#10  pz254v-11-02p  [HDR-TH_2P-P2.54-V-M]  (value not drawn)
H?#11  pz254v-11-02p  [HDR-TH_2P-P2.54-V-M]  (value not drawn)
H?#12  pz254v-11-02p  [HDR-TH_2P-P2.54-V-M]  (value not drawn)
H?#13  pz254v-11-02p  [HDR-TH_2P-P2.54-V-M]  (value not drawn)
H?#14  pz254v-11-02p  [HDR-TH_2P-P2.54-V-M]  (value not drawn)
H?#15  pz254v-11-02p  [HDR-TH_2P-P2.54-V-M]  (value not drawn)
M1  AOD4185-GK  [TO-252-2-GDS]
M2  50N04  [TO-252-2-GDS]
M3  50N04  [TO-252-2-GDS]
N1  (no value)  [TEST-TH_BD2.54-P1.4_RED]
N2  (no value)  [TEST-TH_BD2.54-P1.4_RED]
N3  (no value)  [TEST-TH_BD2.54-P1.4_RED]
N4  (no value)  [TEST-TH_BD2.54-P1.4_RED]
N7  (no value)  [TEST-TH_BD2.54-P1.4_RED]
N8  (no value)  [TEST-TH_BD2.54-P1.4_RED]
N9  (no value)  [TEST-TH_BD2.54-P1.4_RED]
N10  2sd882  [TO-126-3_L7.6-W2.7-P2.29-R]
N11  (no value)  [TEST-TH_BD2.54-P1.4_RED]
N13  MMTB3904  [SOT-23-3_L2.9-W1.3-P1.90-LS2.4-BR - duplicate]
N15  2sd882  [TO-126-3_L7.6-W2.7-P2.29-R]
N16  MMTB3904  [SOT-23-3_L2.9-W1.3-P1.90-LS2.4-BR - duplicate]
N17  (no value)  [TEST-TH_BD2.54-P1.4_RED]
N18  2sd882  [TO-126-3_L7.6-W2.7-P2.29-R]
N20  MMTB3904  [SOT-23-3_L2.9-W1.3-P1.90-LS2.4-BR - duplicate]
N21  MMTB3904  [SOT-23-3_L2.9-W1.3-P1.90-LS2.4-BR - duplicate]
N22  2sd882  [TO-126-3_L7.6-W2.7-P2.29-R]
N23  MMTB3904  [SOT-23-3_L2.9-W1.3-P1.90-LS2.4-BR - duplicate]
N24  MMTB3904  [SOT-23-3_L2.9-W1.3-P1.90-LS2.4-BR - duplicate]
N25  MMTB3904  [SOT-23-3_L2.9-W1.3-P1.90-LS2.4-BR - duplicate]
N28  MMTB3904  [SOT-23-3_L2.9-W1.3-P1.90-LS2.4-BR - duplicate]
N29  MMTB3904  [SOT-23-3_L2.9-W1.3-P1.90-LS2.4-BR - duplicate]
N31  MMTB3904  [SOT-23-3_L2.9-W1.3-P1.90-LS2.4-BR - duplicate]
N32  (no value)  [TEST-TH_BD2.54-P1.4_RED]
N33  (no value)  [TEST-TH_BD2.54-P1.4_RED]
N34  MMTB3904  [SOT-23-3_L2.9-W1.3-P1.90-LS2.4-BR - duplicate]
N35  MMTB3904  [SOT-23-3_L2.9-W1.3-P1.90-LS2.4-BR - duplicate]
N36  MMTB3904  [SOT-23-3_L2.9-W1.3-P1.90-LS2.4-BR - duplicate]
N37  MMTB3904  [SOT-23-3_L2.9-W1.3-P1.90-LS2.4-BR - duplicate]
N38  MMTB3904  [SOT-23-3_L2.9-W1.3-P1.90-LS2.4-BR - duplicate]
N39  MMTB3904  [SOT-23-3_L2.9-W1.3-P1.90-LS2.4-BR - duplicate]
N40  MMTB3904  [SOT-23-3_L2.9-W1.3-P1.90-LS2.4-BR - duplicate]
N41  (no value)  [TEST-TH_BD2.54-P1.4_RED]
N42  (no value)  [TEST-TH_BD2.54-P1.4_RED]
N44  MMTB3904  [SOT-23-3_L2.9-W1.3-P1.90-LS2.4-BR - duplicate]
N46  MMTB3904  [SOT-23-3_L2.9-W1.3-P1.90-LS2.4-BR - duplicate]
N47  MMTB3904  [SOT-23-3_L2.9-W1.3-P1.90-LS2.4-BR - duplicate]
N49  MMTB3904  [SOT-23-3_L2.9-W1.3-P1.90-LS2.4-BR - duplicate]
N51  MMTB3904  [SOT-23-3_L2.9-W1.3-P1.90-LS2.4-BR - duplicate]
N52  MMTB3904  [SOT-23-3_L2.9-W1.3-P1.90-LS2.4-BR - duplicate]
N54  MMTB3904  [SOT-23-3_L2.9-W1.3-P1.90-LS2.4-BR - duplicate]
N55  MMTB3904  [SOT-23-3_L2.9-W1.3-P1.90-LS2.4-BR - duplicate]
N59  MMTB3904  [SOT-23-3_L2.9-W1.3-P1.90-LS2.4-BR - duplicate]
N60  MMTB3904  [SOT-23-3_L2.9-W1.3-P1.90-LS2.4-BR - duplicate]
N61  MMBT3904  [SOT-23-3_L2.9-W1.3-P1.90-LS2.4-BR - duplicate1]
N62  MMTB3904  [SOT-23-3_L2.9-W1.3-P1.90-LS2.4-BR - duplicate]
N63  MMTB3904  [SOT-23-3_L2.9-W1.3-P1.90-LS2.4-BR - duplicate]
N64  MMBT3904  [SOT-23-3_L2.9-W1.3-P1.90-LS2.4-BR - duplicate1]
N65  MMBT3904  [SOT-23-3_L2.9-W1.3-P1.90-LS2.4-BR - duplicate1]
N66  MMTB3904  [SOT-23-3_L2.9-W1.3-P1.90-LS2.4-BR - duplicate]
N67  MMBT3904  [SOT-23-3_L2.9-W1.3-P1.90-LS2.4-BR - duplicate1]
N68  (no value)  [TEST-TH_BD2.54-P1.4_RED]
N69  MMBT3904  [SOT-23-3_L2.9-W1.3-P1.90-LS2.4-BR - duplicate1]
N70  (no value)  [TEST-TH_BD2.54-P1.4_RED]
N71  (no value)  [TEST-TH_BD2.54-P1.4_RED]
N72  MMBT3904  [SOT-23-3_L2.9-W1.3-P1.90-LS2.4-BR - duplicate1]
N73  MMTB3904  [SOT-23-3_L2.9-W1.3-P1.90-LS2.4-BR - duplicate]
N74  (no value)  [TEST-TH_BD2.54-P1.4_RED]
N75  MMBT3904  [SOT-23-3_L2.9-W1.3-P1.90-LS2.4-BR - duplicate1]
N76  MMTB3904  [SOT-23-3_L2.9-W1.3-P1.90-LS2.4-BR - duplicate]
N77  MMBT3904  [SOT-23-3_L2.9-W1.3-P1.90-LS2.4-BR - duplicate1]
N78  MMBT3904  [SOT-23-3_L2.9-W1.3-P1.90-LS2.4-BR - duplicate1]
N79  MMTB3904  [SOT-23-3_L2.9-W1.3-P1.90-LS2.4-BR - duplicate]
N80  (no value)  [TEST-TH_BD2.54-P1.4_RED]
N81  MMTB3904  [SOT-23-3_L2.9-W1.3-P1.90-LS2.4-BR - duplicate]
N82  (no value)  [TEST-TH_BD2.54-P1.4_RED]
N83  MMTB3904  [SOT-23-3_L2.9-W1.3-P1.90-LS2.4-BR - duplicate]
N84  MMTB3904  [SOT-23-3_L2.9-W1.3-P1.90-LS2.4-BR - duplicate]
N85  MMTB3904  [SOT-23-3_L2.9-W1.3-P1.90-LS2.4-BR - duplicate]
N86  MMTB3904  [SOT-23-3_L2.9-W1.3-P1.90-LS2.4-BR - duplicate]
N87  MMTB3904  [SOT-23-3_L2.9-W1.3-P1.90-LS2.4-BR - duplicate]
N88  (no value)  [TEST-TH_BD2.54-P1.4_RED]
N89  (no value)  [TEST-TH_BD2.54-P1.4_RED]
N90  MMTB3904  [SOT-23-3_L2.9-W1.3-P1.90-LS2.4-BR - duplicate]
N91  MMTB3904  [SOT-23-3_L2.9-W1.3-P1.90-LS2.4-BR - duplicate]
N92  (no value)  [TEST-TH_BD2.54-P1.4_RED]
N94  MMTB3904  [SOT-23-3_L2.9-W1.3-P1.90-LS2.4-BR - duplicate]
N95  MMTB3904  [SOT-23-3_L2.9-W1.3-P1.90-LS2.4-BR - duplicate]
N96  MMTB3904  [SOT-23-3_L2.9-W1.3-P1.90-LS2.4-BR - duplicate]
N97  (no value)  [TEST-TH_BD2.54-P1.4_RED]
N98  MMTB3904  [SOT-23-3_L2.9-W1.3-P1.90-LS2.4-BR - duplicate]
N99  (no value)  [TEST-TH_BD2.54-P1.4_RED]
N100  MMTB3904  [SOT-23-3_L2.9-W1.3-P1.90-LS2.4-BR - duplicate]
N101  MMTB3904  [SOT-23-3_L2.9-W1.3-P1.90-LS2.4-BR - duplicate]
N102  MMTB3904  [SOT-23-3_L2.9-W1.3-P1.90-LS2.4-BR - duplicate]
N103  MMTB3904  [SOT-23-3_L2.9-W1.3-P1.90-LS2.4-BR - duplicate]
N104  (no value)  [TEST-TH_BD2.54-P1.4_RED]
N105  MMTB3904  [SOT-23-3_L2.9-W1.3-P1.90-LS2.4-BR - duplicate]
N106  MMTB3904  [SOT-23-3_L2.9-W1.3-P1.90-LS2.4-BR - duplicate]
N107  MMTB3904  [SOT-23-3_L2.9-W1.3-P1.90-LS2.4-BR - duplicate]
N108  (no value)  [TEST-TH_BD2.54-P1.4_RED]
N109  (no value)  [TEST-TH_BD2.54-P1.4_RED]
N110  MMTB3904  [SOT-23-3_L2.9-W1.3-P1.90-LS2.4-BR - duplicate]
N111  MMTB3904  [SOT-23-3_L2.9-W1.3-P1.90-LS2.4-BR - duplicate]
N112  MMTB3904  [SOT-23-3_L2.9-W1.3-P1.90-LS2.4-BR - duplicate]
N113  MMTB3904  [SOT-23-3_L2.9-W1.3-P1.90-LS2.4-BR - duplicate]
N114  MMTB3904  [SOT-23-3_L2.9-W1.3-P1.90-LS2.4-BR - duplicate]
N115  MMTB3904  [SOT-23-3_L2.9-W1.3-P1.90-LS2.4-BR - duplicate]
N116  (no value)  [TEST-TH_BD2.54-P1.4_RED]
N117  MMTB3904  [SOT-23-3_L2.9-W1.3-P1.90-LS2.4-BR - duplicate]
N118  (no value)  [TEST-TH_BD2.54-P1.4_RED]
N119  MMTB3904  [SOT-23-3_L2.9-W1.3-P1.90-LS2.4-BR - duplicate]
N120  (no value)  [TEST-TH_BD2.54-P1.4_RED]
N121  MMTB3904  [SOT-23-3_L2.9-W1.3-P1.90-LS2.4-BR - duplicate]
N122  MMTB3904  [SOT-23-3_L2.9-W1.3-P1.90-LS2.4-BR - duplicate]
N123  MMBT3904  [SOT-23-3_L2.9-W1.3-P1.90-LS2.4-BR - duplicate1]
N124  MMBT3904  [SOT-23-3_L2.9-W1.3-P1.90-LS2.4-BR - duplicate1]
N125  MMBT3904  [SOT-23-3_L2.9-W1.3-P1.90-LS2.4-BR - duplicate1]
N126  MMBT3904  [SOT-23-3_L2.9-W1.3-P1.90-LS2.4-BR - duplicate1]
N127  MMBT3904  [SOT-23-3_L2.9-W1.3-P1.90-LS2.4-BR - duplicate1]
N128  MMBT3904  [SOT-23-3_L2.9-W1.3-P1.90-LS2.4-BR - duplicate1]
N129  MMBT3904  [SOT-23-3_L2.9-W1.3-P1.90-LS2.4-BR - duplicate1]
N130  MMBT3904  [SOT-23-3_L2.9-W1.3-P1.90-LS2.4-BR - duplicate1]
N131  MMBT3904  [SOT-23-3_L2.9-W1.3-P1.90-LS2.4-BR - duplicate1]
N132  (no value)  [TEST-TH_BD2.54-P1.4_RED]
N133  (no value)  [TEST-TH_BD2.54-P1.4_RED]
N134  MMBT3904  [SOT-23-3_L2.9-W1.3-P1.90-LS2.4-BR - duplicate1]
N135  MMBT3904  [SOT-23-3_L2.9-W1.3-P1.90-LS2.4-BR - duplicate1]
N136  MMBT3904  [SOT-23-3_L2.9-W1.3-P1.90-LS2.4-BR - duplicate1]
N137  MMBT3904  [SOT-23-3_L2.9-W1.3-P1.90-LS2.4-BR - duplicate1]
N138  MMBT3904  [SOT-23-3_L2.9-W1.3-P1.90-LS2.4-BR - duplicate1]
N139  MMBT3904  [SOT-23-3_L2.9-W1.3-P1.90-LS2.4-BR - duplicate1]
N140  MMBT3904  [SOT-23-3_L2.9-W1.3-P1.90-LS2.4-BR - duplicate1]
N141  (no value)  [TEST-TH_BD2.54-P1.4_RED]
N142  MMBT3904  [SOT-23-3_L2.9-W1.3-P1.90-LS2.4-BR - duplicate1]
N143  MMBT3904  [SOT-23-3_L2.9-W1.3-P1.90-LS2.4-BR - duplicate1]
N144  MMBT3904  [SOT-23-3_L2.9-W1.3-P1.90-LS2.4-BR - duplicate1]
N145  MMBT3904  [SOT-23-3_L2.9-W1.3-P1.90-LS2.4-BR - duplicate1]
N146  (no value)  [TEST-TH_BD2.54-P1.4_RED]
N147  (no value)  [TEST-TH_BD2.54-P1.4_RED]
N148  MMBT3904  [SOT-23-3_L2.9-W1.3-P1.90-LS2.4-BR - duplicate1]
N149  MMBT3904  [SOT-23-3_L2.9-W1.3-P1.90-LS2.4-BR - duplicate1]
N150  MMBT3904  [SOT-23-3_L2.9-W1.3-P1.90-LS2.4-BR - duplicate1]
N151  MMBT3904  [SOT-23-3_L2.9-W1.3-P1.90-LS2.4-BR - duplicate1]
N152  MMBT3904  [SOT-23-3_L2.9-W1.3-P1.90-LS2.4-BR - duplicate1]
N153  MMBT3904  [SOT-23-3_L2.9-W1.3-P1.90-LS2.4-BR - duplicate1]
N154  MMBT3904  [SOT-23-3_L2.9-W1.3-P1.90-LS2.4-BR - duplicate1]
N155  MMBT3904  [SOT-23-3_L2.9-W1.3-P1.90-LS2.4-BR - duplicate1]
N156  (no value)  [TEST-TH_BD2.54-P1.4_RED]
N157  (no value)  [TEST-TH_BD2.54-P1.4_RED]
N158  MMBT3904  [SOT-23-3_L2.9-W1.3-P1.90-LS2.4-BR - duplicate1]
N159  MMBT3904  [SOT-23-3_L2.9-W1.3-P1.90-LS2.4-BR - duplicate1]
N160  (no value)  [TEST-TH_BD2.54-P1.4_RED]
N161  MMBT3904  [SOT-23-3_L2.9-W1.3-P1.90-LS2.4-BR - duplicate1]
N162  (no value)  [TEST-TH_BD2.54-P1.4_RED]
N163  MMBT3904  [SOT-23-3_L2.9-W1.3-P1.90-LS2.4-BR - duplicate1]
N164  MMBT3904  [SOT-23-3_L2.9-W1.3-P1.90-LS2.4-BR - duplicate1]
N165  MMBT3904  [SOT-23-3_L2.9-W1.3-P1.90-LS2.4-BR - duplicate1]
N166  MMBT3904  [SOT-23-3_L2.9-W1.3-P1.90-LS2.4-BR - duplicate1]
N167  MMBT3904  [SOT-23-3_L2.9-W1.3-P1.90-LS2.4-BR - duplicate1]
N168  MMBT3904  [SOT-23-3_L2.9-W1.3-P1.90-LS2.4-BR - duplicate1]
N169  MMBT3904  [SOT-23-3_L2.9-W1.3-P1.90-LS2.4-BR - duplicate1]
N170  MMBT3904  [SOT-23-3_L2.9-W1.3-P1.90-LS2.4-BR - duplicate1]
N171  MMBT3904  [SOT-23-3_L2.9-W1.3-P1.90-LS2.4-BR - duplicate1]
N172  MMBT3904  [SOT-23-3_L2.9-W1.3-P1.90-LS2.4-BR - duplicate1]
N173  MMBT3904  [SOT-23-3_L2.9-W1.3-P1.90-LS2.4-BR - duplicate1]
N174  (no value)  [TEST-TH_BD2.54-P1.4_RED]
N175  (no value)  [TEST-TH_BD2.54-P1.4_RED]
N176  (no value)  [TEST-TH_BD2.54-P1.4_RED]
N177  (no value)  [TEST-TH_BD2.54-P1.4_RED]
N178  MMBT3904  [SOT-23-3_L2.9-W1.3-P1.90-LS2.4-BR - duplicate1]
N179  MMBT3904  [SOT-23-3_L2.9-W1.3-P1.90-LS2.4-BR - duplicate1]
N180  MMBT3904  [SOT-23-3_L2.9-W1.3-P1.90-LS2.4-BR - duplicate1]
N181  (no value)  [TEST-TH_BD2.54-P1.4_RED]
N182  MMBT3904  [SOT-23-3_L2.9-W1.3-P1.90-LS2.4-BR - duplicate1]
N183  MMBT3904  [SOT-23-3_L2.9-W1.3-P1.90-LS2.4-BR - duplicate1]
N184  MMBT3904  [SOT-23-3_L2.9-W1.3-P1.90-LS2.4-BR - duplicate1]
N185  MMBT3904  [SOT-23-3_L2.9-W1.3-P1.90-LS2.4-BR - duplicate1]
N186  MMBT3904  [SOT-23-3_L2.9-W1.3-P1.90-LS2.4-BR - duplicate1]
N187  MMBT3904  [SOT-23-3_L2.9-W1.3-P1.90-LS2.4-BR - duplicate1]
N188  MMBT3904  [SOT-23-3_L2.9-W1.3-P1.90-LS2.4-BR - duplicate1]
N189  MMBT3904  [SOT-23-3_L2.9-W1.3-P1.90-LS2.4-BR - duplicate1]
N190  (no value)  [TEST-TH_BD2.54-P1.4_RED]
N191  MMTB3904  [SOT-23-3_L2.9-W1.3-P1.90-LS2.4-BR - duplicate]
N192  (no value)  [TEST-TH_BD2.54-P1.4_RED]
N193  (no value)  [TEST-TH_BD2.54-P1.4_RED]
N194  (no value)  [TEST-TH_BD2.54-P1.4_RED]
N195  (no value)  [TEST-TH_BD2.54-P1.4_RED]
N196  (no value)  [TEST-TH_BD2.54-P1.4_RED]
N197  (no value)  [TEST-TH_BD2.54-P1.4_RED]
N198  (no value)  [TEST-TH_BD2.54-P1.4_RED]
N199  (no value)  [TEST-TH_BD2.54-P1.4_RED]
N200  (no value)  [TEST-TH_BD2.54-P1.4_RED]
N?#1  2sd882  [TO-126-3_L7.6-W2.7-P2.29-R]
N?#2  MMTB3904  [SOT-23-3_L2.9-W1.3-P1.90-LS2.4-BR - duplicate]
N?#3  2sd882  [TO-126-3_L7.6-W2.7-P2.29-R]
N?#4  MMTB3904  [SOT-23-3_L2.9-W1.3-P1.90-LS2.4-BR - duplicate]
N?#5  MMTB3904  [SOT-23-3_L2.9-W1.3-P1.90-LS2.4-BR - duplicate]
N?#6  MMTB3904  [SOT-23-3_L2.9-W1.3-P1.90-LS2.4-BR - duplicate]
N?#7  MMTB3904  [SOT-23-3_L2.9-W1.3-P1.90-LS2.4-BR - duplicate]
N?#8  MMTB3904  [SOT-23-3_L2.9-W1.3-P1.90-LS2.4-BR - duplicate]
N?#9  MMTB3904  [SOT-23-3_L2.9-W1.3-P1.90-LS2.4-BR - duplicate]
N?#10  MMTB3904  [SOT-23-3_L2.9-W1.3-P1.90-LS2.4-BR - duplicate]
N?#11  MMTB3904  [SOT-23-3_L2.9-W1.3-P1.90-LS2.4-BR - duplicate]
N?#12  MMTB3904  [SOT-23-3_L2.9-W1.3-P1.90-LS2.4-BR - duplicate]
N?#13  MMTB3904  [SOT-23-3_L2.9-W1.3-P1.90-LS2.4-BR - duplicate]
N?#14  MMTB3904  [SOT-23-3_L2.9-W1.3-P1.90-LS2.4-BR - duplicate]
N?#15  (no value)  [TEST-TH_BD2.54-P1.4_RED]
N?#16  (no value)  [TEST-TH_BD2.54-P1.4_RED]
N?#17  (no value)  [TEST-TH_BD2.54-P1.4_RED]
N?#18  (no value)  [TEST-TH_BD2.54-P1.4_RED]
N?#19  (no value)  [TEST-TH_BD2.54-P1.4_RED]
N?#20  (no value)  [TEST-TH_BD2.54-P1.4_RED]
N?#21  (no value)  [TEST-TH_BD2.54-P1.4_RED]
N?#22  MMTB3904  [SOT-23-3_L2.9-W1.3-P1.90-LS2.4-BR - duplicate]
N?#23  MMTB3904  [SOT-23-3_L2.9-W1.3-P1.90-LS2.4-BR - duplicate]
N?#24  (no value)  [TEST-TH_BD2.54-P1.4_RED]
N?#25  MMTB3904  [SOT-23-3_L2.9-W1.3-P1.90-LS2.4-BR - duplicate]
N?#26  (no value)  [TEST-TH_BD2.54-P1.4_RED]
N?#27  (no value)  [TEST-TH_BD2.54-P1.4_RED]
N?#28  MMTB3904  [SOT-23-3_L2.9-W1.3-P1.90-LS2.4-BR - duplicate]
N?#29  MMTB3904  [SOT-23-3_L2.9-W1.3-P1.90-LS2.4-BR - duplicate]
N?#30  (no value)  [TEST-TH_BD2.54-P1.4_RED]
N?#31  (no value)  [TEST-TH_BD2.54-P1.4_RED]
P3  MMBT3906  [SOT-23-3_L2.9-W1.3-P1.90-LS2.4-BR]
P4  MMBT3906  [SOT-23-3_L2.9-W1.3-P1.90-LS2.4-BR]
P5  MMBT3906  [SOT-23-3_L2.9-W1.3-P1.90-LS2.4-BR]
P6  MMBT3906  [SOT-23-3_L2.9-W1.3-P1.90-LS2.4-BR]
P7  MMBT3906  [SOT-23-3_L2.9-W1.3-P1.90-LS2.4-BR]
P8  MMBT3906  [SOT-23-3_L2.9-W1.3-P1.90-LS2.4-BR - duplicate]
P9  MMBT3906  [SOT-23-3_L2.9-W1.3-P1.90-LS2.4-BR]
P11  MMBT3906  [SOT-23-3_L2.9-W1.3-P1.90-LS2.4-BR]
P12  MMBT3906  [SOT-23-3_L2.9-W1.3-P1.90-LS2.4-BR]
P13  MMBT3906  [SOT-23-3_L2.9-W1.3-P1.90-LS2.4-BR]
P14  MMBT3906  [SOT-23-3_L2.9-W1.3-P1.90-LS2.4-BR]
P15  MMBT3906  [SOT-23-3_L2.9-W1.3-P1.90-LS2.4-BR]
P16  MMBT3906  [SOT-23-3_L2.9-W1.3-P1.90-LS2.4-BR]
P17  MMBT3906  [SOT-23-3_L2.9-W1.3-P1.90-LS2.4-BR]
P18  MMBT3906  [SOT-23-3_L2.9-W1.3-P1.90-LS2.4-BR]
P19  MMBT3906  [SOT-23-3_L2.9-W1.3-P1.90-LS2.4-BR]
P20  MMBT3906  [SOT-23-3_L2.9-W1.3-P1.90-LS2.4-BR]
P21  MMBT3906  [SOT-23-3_L2.9-W1.3-P1.90-LS2.4-BR]
P22  MMBT3906  [SOT-23-3_L2.9-W1.3-P1.90-LS2.4-BR]
P23  MMBT3906  [SOT-23-3_L2.9-W1.3-P1.90-LS2.4-BR]
P24  MMBT3906  [SOT-23-3_L2.9-W1.3-P1.90-LS2.4-BR]
P25  MMBT3906  [SOT-23-3_L2.9-W1.3-P1.90-LS2.4-BR]
P26  MMBT3906  [SOT-23-3_L2.9-W1.3-P1.90-LS2.4-BR]
P27  MMBT3906  [SOT-23-3_L2.9-W1.3-P1.90-LS2.4-BR]
P28  MMBT3906  [SOT-23-3_L2.9-W1.3-P1.90-LS2.4-BR]
P29  MMBT3906  [SOT-23-3_L2.9-W1.3-P1.90-LS2.4-BR]
P30  MMBT3906  [SOT-23-3_L2.9-W1.3-P1.90-LS2.4-BR]
P31  MMBT3906  [SOT-23-3_L2.9-W1.3-P1.90-LS2.4-BR]
P32  MMBT3906  [SOT-23-3_L2.9-W1.3-P1.90-LS2.4-BR]
P33  MMBT3906  [SOT-23-3_L2.9-W1.3-P1.90-LS2.4-BR]
P34  MMBT3906  [SOT-23-3_L2.9-W1.3-P1.90-LS2.4-BR]
P35  MMBT3906  [SOT-23-3_L2.9-W1.3-P1.90-LS2.4-BR]
P36  MMBT3906  [SOT-23-3_L2.9-W1.3-P1.90-LS2.4-BR]
P37  MMBT3906  [SOT-23-3_L2.9-W1.3-P1.90-LS2.4-BR]
P38  MMBT3906  [SOT-23-3_L2.9-W1.3-P1.90-LS2.4-BR]
P39  MMBT3906  [SOT-23-3_L2.9-W1.3-P1.90-LS2.4-BR]
P40  MMBT3906  [SOT-23-3_L2.9-W1.3-P1.90-LS2.4-BR]
P41  MMBT3906  [SOT-23-3_L2.9-W1.3-P1.90-LS2.4-BR]
P42  MMBT3906  [SOT-23-3_L2.9-W1.3-P1.90-LS2.4-BR]
P43  MMBT3906  [SOT-23-3_L2.9-W1.3-P1.90-LS2.4-BR]
P44  MMBT3906  [SOT-23-3_L2.9-W1.3-P1.90-LS2.4-BR]
P45  MMBT3906  [SOT-23-3_L2.9-W1.3-P1.90-LS2.4-BR]
P46  MMBT3906  [SOT-23-3_L2.9-W1.3-P1.90-LS2.4-BR]
P47  MMBT3906  [SOT-23-3_L2.9-W1.3-P1.90-LS2.4-BR]
P48  MMBT3906  [SOT-23-3_L2.9-W1.3-P1.90-LS2.4-BR]
P49  MMBT3906  [SOT-23-3_L2.9-W1.3-P1.90-LS2.4-BR]
P50  MMBT3906  [SOT-23-3_L2.9-W1.3-P1.90-LS2.4-BR]
P?#1  MMBT3906  [SOT-23-3_L2.9-W1.3-P1.90-LS2.4-BR]
P?#2  MMBT3906  [SOT-23-3_L2.9-W1.3-P1.90-LS2.4-BR]
P?#3  MMBT3906  [SOT-23-3_L2.9-W1.3-P1.90-LS2.4-BR]
Q1  do4085a  [SOT-23-3_L2.9-W1.6-P1.90-LS2.8-BR]
Q2  MMTB3904  [SOT-23-3_L2.9-W1.3-P1.90-LS2.4-BR - duplicate]
Q3  MMTB3904  [SOT-23-3_L2.9-W1.3-P1.90-LS2.4-BR - duplicate]
Q6  B772  [SOT-89(SOT-89-3)]
Q7  B772  [SOT-89(SOT-89-3)]
Q8  B772  [SOT-89(SOT-89-3)]
Q??  b772  [SOT-89-3_L4.5-W2.5-P1.50-LS4.2-BR]
R1  0805-100Ω-5%  [R0603]
R2  0805-100Ω-5%  [R0603]
R6  0805-100Ω-5%  [R0603]
R8  0805-100Ω-5%  [R0603]
R9  0805-100Ω-5%  [R0603]
R10  0805-100Ω-5%  [R0603]
R11  0805-10KΩ-5%  [R0603]
R12  0805-6KΩ-5%  [R0603]
R13  0805-10kΩ-5%  [R0603]
R14  0805-6KΩ-5%  [R0603]
R16  0805-100Ω-5%  [R0603]
R18  0805-100Ω-5%  [R0603]
R19  0805-100Ω-5%  [R0603]
R20  0805-100Ω-5%  [R0603]
R22  0805-6kΩ-5%  [R0603]
R23  0805-6kΩ-5%  [R0603]
R24  0805-5.1KΩ-5%  [R0603]
R26  0805-10KΩ-5%  [R0603]
R27  0805-10KΩ-5%  [R0603]
R28  0805-240Ω-5%  [R0603]
R29  0805-5.1KΩ-5%  [R0603]
R30  0805-0.3Ω-5%  [R0603]
R31  0805-3.3KΩ-5%  [R0603]
R32  0805-200Ω-5%  [R0603]
R33  0805-1KΩ-5%  [R0603]
R36  3296W-1-103_C48997937  (value not drawn)
R37  0805-2KΩ-5%  [R0603]
R38  0805-20KΩ-5%  [R0603]
R39  0805-240Ω-5%  [R0603]
R40  0805-20KΩ-5%  [R0603]
R41  0805-10KΩ-5%  [R0603]
R42  0805-2KΩ-5%  [R0603]
R43  0805-0.3Ω-5%  [R0603]
R44  0805-200Ω-5%  [R0603]
R45  0805-3.3kΩ-5%  [R0603]
R46  0805-10KΩ-5%  [R0603]
R48  0805-6kΩ-5%  [R0603]
R49  0805-2.7KΩ-5%  [R0603]
R50  0805-6kΩ-5%  [R0603]
R53  0805-5kΩ-5%  [R0603]
R56  0805-20kΩ-5%  [R0603]
R57  0805-1kΩ-5%  [R0603]
R59  0805-2.7kΩ-5%  [R0603]
R60  0805-6KΩ-5%  [R0603]
R61  0805-2KΩ-5%  [R0603]
R63  0805-6KΩ-5%  [R0603]
R65  0805-5KΩ-5%  [R0603]
R66  0805-500Ω-5%  [R0603]
R67  0805-1KΩ-5%  [R0603]
R68  0805-20KΩ-5%  [R0603]
R70  0805-2KΩ-5%  [R0603]
R71  0805-2KΩ-5%  [R0603]
R72  0805-1kΩ-5%  [R0603]
R73  0805-1kΩ-5%  [R0603]
R74  0805-6kΩ-5%  [R0603]
R75  0805-500Ω-5%  [R0603]
R80  0805-1KΩ-5%  [R0603]
R82  0805-1KΩ-5%  [R0603]
R83  0805-1KΩ-5%  [R0603]
R84  0805-75Ω-5%  [R0603]
R85  0805-20KΩ-5%  [R0603]
R86  0805-10KΩ-5%  [R0603]
R87  0805-8KΩ-5%  [R0603]
R88  0805-75Ω-5%  [R0603]
R89  0805-20KΩ-5%  [R0603]
R90  0805-10KΩ-5%  [R0603]
R91  0805-8KΩ-5%  [R0603]
R92  0805-33Ω-5%  [R0603]
R93  0805-2KΩ-5%  [R0603]
R94  0805-100Ω-5%  [R0603]
R95  0805-2KΩ-5%  [R0603]
R96  0805-1KΩ-5%  [R0603]
R97  0805-4.7KΩ-5%  [R0603]
R98  0805-4.7KΩ-5%  [R0603]
R99  0805-4.5KΩ-5%  [R0603]
R100  0805-50Ω-5%  [R0603]
R101  0805-10Ω-5%  [R0603]
R102  0805-4.5KΩ-5%  [R0603]
R103  0805-2KΩ-5%  [R0603]
R104  0805-33Ω-5%  [R0603]
R105  0805-3KΩ-5%  [R0603]
R106  0805-2KΩ-5%  [R0603]
R107  0805-4.7KΩ-5%  [R0603]
R108  0805-3KΩ-5%  [R0603]
R109  0805-1.5KΩ-5%  [R0603]
R110  0805-20K-5%  [R0603]
R111  0805-1.5KΩ-5%  [R0603]
R112  0805-4.7KΩ-5%  [R0603]
R113  0805-75KΩ-5%  [R0603]
R114  0805-2KΩ-5%  [R0603]
R115  0805-8KΩ-5%  [R0603]
R116  0805-820Ω-5%  [R0603]
R117  0805-20KΩ-5%  [R0603]
R118  0805-11KΩ-5%  [R0603]
R119  0805-4.7KΩ-5%  [R0603]
R120  0805-20KΩ-5%  [R0603]
R121  0805-4.7KΩ-5%  [R0603]
R122  0805-20KΩ-5%  [R0603]
R123  0805-1KΩ-5%  [R0603]
R124  0805-8KΩ-5%  [R0603]
R125  0805-75Ω-5%  [R0603]
R126  0805-20KΩ-5%  [R0603]
R127  0805-6.8KΩ-5%  [R0603]
R128  0805-6.48KΩ-5%  [R0603]
R129  0805-1KΩ-5%  [R0603]
R130  0805-4.7KΩ-5%  [R0603]
R131  0805-560Ω-5%  [R0603]
R132  0805-2KΩ-5%  [R0603]
R133  0805-560Ω-5%  [R0603]
R134  0805-3.9KΩ-5%  [R0603]
R135  3296w-1-202lf  [RES-ADJ-TH_3296W]  (value not drawn)
R136  0805-15KΩ-5%  [R0603]
R137  0805-4.7KΩ-5%  [R0603]
R138  0805-1KΩ-5%  [R0603]
R139  0805-4.5KΩ-5%  [R0603]
R140  0805-1KΩ-5%  [R0603]
R141  0805-4.5KΩ-5%  [R0603]
R142  0805-220Ω-5%  [R0603]
R143  0805-4.7KΩ-5%  [R0603]
R144  0805-3KΩ-5%  [R0603]
R145  0805-3KΩ-5%  [R0603]
R146  0805-1.5KΩ-5%  [R0603]
R147  0805-100Ω-5%  [R0603]
R148  0805-100kΩ-5%  [R0603]
R149  0805-10KΩ-5%  [R0603]
R150  0805-4.7KΩ-5%  [R0603]
R151  0805-1.5KΩ-5%  [R0603]
R152  0805-4.7KΩ-5%  [R0603]
R153  0805-47Ω-5%  [R0603]
R154  0805-75Ω-5%  [R0603]
R155  0805-20KΩ-5%  [R0603]
R156  0805-10KΩ-5%  [R0603]
R157  0805-8KΩ-5%  [R0603]
R158  0805-75Ω-5%  [R0603]
R159  0805-100KΩ-5%  [R0603]
R160  0805-20KΩ-5%  [R0603]
R161  0805-10KΩ-5%  [R0603]
R162  0805-8KΩ-5%  [R0603]
R163  0805-1KΩ-5%  [R0603]
R164  0805-2KΩ-5%  [R0603]
R165  0805-100Ω-5%  [R0603]
R166  0805-4.7KΩ-5%  [R0603]
R167  0805-1KΩ-5%  [R0603]
R168  0805-4.5KΩ-5%  [R0603]
R169  0805-50Ω-5%  [R0603]
R170  0805-10Ω-5%  [R0603]
R171  0805-4.5KΩ-5%  [R0603]
R172  0805-2KΩ-5%  [R0603]
R173  0805-33Ω-5%  [R0603]
R174  0805-3KΩ-5%  [R0603]
R175  0805-10KΩ-5%  [R0603]
R176  0805-2KΩ-5%  [R0603]
R177  0805-3KΩ-5%  [R0603]
R178  0805-1.5KΩ-5%  [R0603]
R179  0805-1.5KΩ-5%  [R0603]
R180  0805-2KΩ-5%  [R0603]
R181  0805-20KΩ-5%  [R0603]
R182  0805-20KΩ-5%  [R0603]
R183  0805-8KΩ-5%  [R0603]
R184  0805-75KΩ-5%  [R0603]
R185  0805-1.2KΩ-1%  [R-2512]
R186  0805-4.5KΩ-5%  [R0603]
R187  0805-10KΩ-1%  [R-2512]
R188  0805-3KΩ-5%  [R0603]
R189  0805-1.5KΩ-5%  [R0603]
R190  0805-2KΩ-5%  [R0603]
R191  0805-750Ω-1%  [R-2512]
R192  0805-750Ω-1%  [R-2512]
R193  0805-1KΩ-5%  [R0603]
R195  0805-10KΩ-5%  [R0603]
R196  0805-820Ω-5%  [R0603]
R197  0805-680Ω-5%  [R0603]
R198  0805-5.6KΩ-5%  [R0603]
R199  0805-1KΩ-5%  [R0603]
R200  0805-10KΩ-5%  [R0603]
R201  0805-10KΩ-5%  [R0603]
R202  0805-150Ω-1%  [R-2512]
R203  0805-20KΩ-5%  [R0603]
R204  0805-20KΩ-5%  [R0603]
R205  0805-8KΩ-5%  [R0603]
R206  0805-75KΩ-5%  [R0603]
R207  0805-3.3KΩ-1%  [R-2512]
R208  0805-10KΩ-1%  [R-2512]
R209  0805-2KΩ-5%  [R0603]
R210  0805-4.7KΩ-5%  [R0603]
R211  3296w-1-202lf  [RES-ADJ-TH_3296W]  (value not drawn)
R212  0805-750Ω-1%  [R-2512]
R213  0805-3.9KΩ-1%  [R-2512]
R214  0805-3.6KΩ-1%  [R-2512]
R215  0805-3.6KΩ-1%  [R-2512]
R216  0805-2KΩ-5%  [R0603]
R217  0805-100Ω-5%  [R0603]
R218  0805-2KΩ-5%  [R0603]
R219  0805-4.5KΩ-5%  [R0603]
R220  0805-10KΩ-5%  [R0603]
R221  0805-2KΩ-5%  [R0603]
R222  0805-2KΩ-5%  [R0603]
R223  0805-2KΩ-5%  [R0603]
R225  0805-150Ω-5%  [R0603]
R226  0805-3KΩ-5%  [R0603]
R227  0805-2KΩ-5%  [R0603]
R228  0805-2KΩ-5%  [R0603]
R229  0805-4.2KΩ-5%  [R0603]
R230  0805-1KΩ-1%  [R-2512]
R231  0805-1.5KΩ-5%  [R0603]
R232  0805-2KΩ-5%  [R0603]
R233  0805-2KΩ-5%  [R0603]
R234  0805-750Ω-1%  [R-2512]
R235  0805-820Ω-5%  [R0603]
R236  0805-680Ω-5%  [R0603]
R237  0805-5.6KΩ-5%  [R0603]
R238  0805-1KΩ-5%  [R0603]
R239  0805-820Ω-5%  [R0603]
R240  0805-4.7KΩ-5%  [R0603]
R241  0805-2KΩ-5%  [R0603]
R242  0805-10K-5%  [R0603]
R243  0805-10K-5%  [R0603]
R244  0805-2KΩ-5%  [R0603]
R245  0805-20KΩ-5%  [R0603]
R246  0805-6.2KΩ-5%  [R0603]
R?#1  0805-100Ω-5%  [R0603]
R?#2  0805-100Ω-5%  [R0603]
R?#3  0805-6kΩ-5%  [R0603]
R?#4  0805-6kΩ-5%  [R0603]
R?#5  0805-10KΩ-5%  [R0603]
R?#6  0805-240Ω-5%  [R0603]
R?#7  0805-0.3Ω-5%  [R0603]
R?#8  0805-200Ω-5%  [R0603]
R?#9  0805-3.3kΩ-5%  [R0603]
R?#10  3296w-1-202lf  [RES-ADJ-TH_3296W]  (value not drawn)
R?#11  3296w-1-202lf  [RES-ADJ-TH_3296W]  (value not drawn)
R?#12  0805-2.7kΩ-5%  [R0603]
R?#13  0805-6KΩ-5%  [R0603]
R?#14  0805-6KΩ-5%  [R0603]
R?#15  0805-5KΩ-5%  [R0603]
R?#16  0805-1KΩ-5%  [R0603]
R?#17  0805-20KΩ-5%  [R0603]
R?#18  0805-500Ω-5%  [R0603]
R?#19  0805-1KΩ-5%  [R0603]
R?#20  0805-1KΩ-5%  [R0603]
R?#21  0805-1KΩ-5%  [R0603]
R?#22  0805-8KΩ-5%  [R0603]
R?#23  0805-75Ω-5%  [R0603]
R?#24  0805-20KΩ-5%  [R0603]
R?#25  0805-4.5KΩ-5%  [R0603]
R?#26  0805-3KΩ-5%  [R0603]
R?#27  0805-1.5KΩ-5%  [R0603]
R?#28  3296w-1-202lf  [RES-ADJ-TH_3296W]  (value not drawn)
R?#29  3296w-1-202lf  [RES-ADJ-TH_3296W]  (value not drawn)
RTCT1  (no value)  [TEST-TH_BD2.54-P1.4_RED]
U1  bf256b  [TO-92-3_L4.6-W3.9-P1.27-L]
ZD2  1N4148WT  [SOD-523_L1.2-W0.8-LS1.6-FD]
ZD3  1N4148WT  [SOD-523_L1.2-W0.8-LS1.6-FD]
ZD4  1N4148WT  [SOD-523_L1.2-W0.8-LS1.6-FD]
ZD5  BZD52C15  [SOD-123_L2.7-W1.6-LS3.7-RD]
ZD6  BZD52C27  [SOD-123_L2.7-W1.6-LS3.7-RD]
ZD7  BZD52C30  [SOD-123_L2.7-W1.6-LS3.7-RD]
ZD8  1N4148WT  [SOD-523_L1.2-W0.8-LS1.6-FD]
ZD9  BZD52C7.5  [SOD-123_L2.7-W1.6-LS3.7-RD]
ZD10  1N4148WT  [SOD-523_L1.2-W0.8-LS1.6-FD]
ZD11  BZD52C15  [SOD-123_L2.7-W1.6-LS3.7-RD]
ZD13  BZD52C20  [SOD-123_L2.7-W1.6-LS3.7-RD]
ZD14  1N4148WT  [SOD-523_L1.2-W0.8-LS1.6-FD]
ZD15  1N4148WT  [SOD-523_L1.2-W0.8-LS1.6-FD]
ZD16  1N4148WT  [SOD-523_L1.2-W0.8-LS1.6-FD]
ZD17  1N4148WT  [SOD-523_L1.2-W0.8-LS1.6-FD]
ZD18  1N4148WT  [SOD-523_L1.2-W0.8-LS1.6-FD]
ZD19  1N4148WT  [SOD-523_L1.2-W0.8-LS1.6-FD]
ZD20  1N4148WT  [SOD-523_L1.2-W0.8-LS1.6-FD]
ZD21  1N4148WT  [SOD-523_L1.2-W0.8-LS1.6-FD]
ZD22  1N4148WT  [SOD-523_L1.2-W0.8-LS1.6-FD]
ZD23  1N4148WT  [SOD-523_L1.2-W0.8-LS1.6-FD]
ZD24  1N4148WT  [SOD-523_L1.2-W0.8-LS1.6-FD]
ZD25  1N4148WT  [SOD-523_L1.2-W0.8-LS1.6-FD]
ZD26  BZD52C6V  [SOD-123_L2.7-W1.6-LS3.7-RD]
ZD27  1N4148WT  [SOD-523_L1.2-W0.8-LS1.6-FD]
ZD28  1N4148WT  [SOD-523_L1.2-W0.8-LS1.6-FD]
ZD29  1N4148WT  [SOD-523_L1.2-W0.8-LS1.6-FD]
ZD30  1N4148WT  [SOD-523_L1.2-W0.8-LS1.6-FD]
ZD31  1N4148WT  [SOD-523_L1.2-W0.8-LS1.6-FD]
ZD32  1N4148WT  [SOD-523_L1.2-W0.8-LS1.6-FD]
ZD33  BZD52C10V  [SOD-123_L2.7-W1.6-LS3.7-RD]
ZD34  1N4148WT  [SOD-523_L1.2-W0.8-LS1.6-FD]
ZD35  1N4148WT  [SOD-523_L1.2-W0.8-LS1.6-FD]
ZD36  1N4148WT  [SOD-523_L1.2-W0.8-LS1.6-FD]
ZD37  1N4148WT  [SOD-523_L1.2-W0.8-LS1.6-FD]
ZD38  1N4148WT  [SOD-523_L1.2-W0.8-LS1.6-FD]
ZD39  1N4148WT  [SOD-523_L1.2-W0.8-LS1.6-FD]
ZD40  1N4148WT  [SOD-523_L1.2-W0.8-LS1.6-FD]
ZD41  1N4148WT  [SOD-523_L1.2-W0.8-LS1.6-FD]
ZD42  1N4148WT  [SOD-523_L1.2-W0.8-LS1.6-FD]
ZD43  1N4148WT  [SOD-523_L1.2-W0.8-LS1.6-FD]
ZD44  1N4148WT  [SOD-523_L1.2-W0.8-LS1.6-FD]
ZD45  1N4148WT  [SOD-523_L1.2-W0.8-LS1.6-FD]
ZD46  1N4148WT  [SOD-523_L1.2-W0.8-LS1.6-FD]
ZD47  1N4148WT  [SOD-523_L1.2-W0.8-LS1.6-FD]
ZD48  1N4148WT  [SOD-523_L1.2-W0.8-LS1.6-FD]
ZD49  1N4148WT  [SOD-523_L1.2-W0.8-LS1.6-FD]
ZD50  1N4148WT  [SOD-523_L1.2-W0.8-LS1.6-FD]
ZD51  1N4148WT  [SOD-523_L1.2-W0.8-LS1.6-FD]
ZD52  1N4148WT  [SOD-523_L1.2-W0.8-LS1.6-FD]
ZD53  1N4148WT  [SOD-523_L1.2-W0.8-LS1.6-FD]
ZD54  1N4148WT  [SOD-523_L1.2-W0.8-LS1.6-FD]
ZD55  1N4148WT  [SOD-523_L1.2-W0.8-LS1.6-FD]
ZD56  1N4148WT  [SOD-523_L1.2-W0.8-LS1.6-FD]
ZD57  1N4148WT  [SOD-523_L1.2-W0.8-LS1.6-FD]
ZD58  1N4148WT  [SOD-523_L1.2-W0.8-LS1.6-FD]
ZD59  1N4148WT  [SOD-523_L1.2-W0.8-LS1.6-FD]
ZD60  1N4148WT  [SOD-523_L1.2-W0.8-LS1.6-FD]
ZD61  1N4148WT  [SOD-523_L1.2-W0.8-LS1.6-FD]
ZD62  1N4148WT  [SOD-523_L1.2-W0.8-LS1.6-FD]
ZD63  1N4148WT  [SOD-523_L1.2-W0.8-LS1.6-FD]
ZD64  1N4148WT  [SOD-523_L1.2-W0.8-LS1.6-FD]
ZD65  BZD52C3V3  [SOD-123_L2.7-W1.6-LS3.7-RD]
ZD66  1N4148WT  [SOD-523_L1.2-W0.8-LS1.6-FD]
ZD67  1N4148WT  [SOD-523_L1.2-W0.8-LS1.6-FD]
ZD68  1N4148WT  [SOD-523_L1.2-W0.8-LS1.6-FD]
ZD69  BZD52C3V3  [SOD-123_L2.7-W1.6-LS3.7-RD]

## Blocks framed on the sheet
外部芯片引脚端口: H?#1-H?#10
7812: C3 C4 D1 D3 N10 N13 N15 N16 N20 N24 N25 N28 N38-N40 N44 N46 N47 P3 P4 P9 R9 R10 R12-R14 R28 R30-R32 R36 R48-R50 R53 R56 R57 R66 R72-R74
双阈值电路: C11 N7 N29 P5 R24 R29 R33 ZD9 ZD11
7810: C12 C13 D2 D5 N18 N21-N23 N31 N34 N36 N37 N49 N51 N52 N54 N55 N59 P6 P7 P11 R18 R20 R22 R23 R26 R39 R43-R45 R59 R60 R63 R65 R67 R68 R75 R80 R82 R83 R?#10
7805: C5 C7 D?#1 D?#2 H3 N17 N?#1-N?#14 P?#1-P?#3 R?#1-R?#9 R?#11-R?#21 ZD2
内部电源和外部电源选择: H2 H4 M1 R46 ZD3 ZD8
与门: C42 H9 N60 N62 N63 N66 N73 N76 R84-R87 R99 R105 R109 ZD14 ZD15 ZD19 ZD21 ZD22 ZD27 ZD28 ZD31
与门: C43 N61 N64 N65 N67 N68 N75 N77 R88-R91 R102 R108 R111 ZD16 ZD17 ZD20 ZD23 ZD25 ZD29 ZD30 ZD32
上桥驱动: C24 C44 N69 N70 N72 N74 N78 N80 P12-P14 R92 R93 R95 R97 R98 R101 R103 R104 R106 R107 R110 R112 R114 ZD18 ZD24 ZD26 ZD33
三输入或门: C45 D7-D9 D11 D14 D15 D18 D20-D23 H17 H43 H44 N81 N87 N89 N101 N104 N108 N111 N113-N115 N119 N?#17 R113 R115 R117 R118 R120 R122 R141 R145 R151
非门: C46 D10 D12 D16 D17 D19 H19 N86 N91 N96 N110 N117 N?#18 N?#19 R124-R126 R139 R144 R146
信号级施密特触发器（5V欠压保护）: C49 D13 H12 H?#12 N84 N92 N95 N97 N105 N109 N190 N191 R131-R133 R163 ZD35 ZD65
阈值比较器: C29 N94 N98 N103 N106 N116 P17-P20 R116 R119 R121 R149
触发比较器: N99 P21 P23-P26 R123 R159
触发器: N82 N100 N107 N112 N121 P15 P16 R136 R137
输出: H15 N79 N83 N85 N88 N102 N118 N120 N122 P22 P27 R127 R134 R142 R147 R148 R152
PWM取反输出: C25 N90 R129 R138 R140
与门: C50 H27 N123 N125 N126 N130 N135 N137 R154-R157 R168 R174 R178 ZD37 ZD38 ZD41 ZD43 ZD44 ZD48 ZD49 ZD52
与门: C51 N124 N127 N128 N131 N136 N138 R158 R160-R162 R171 R177 R179 ZD39 ZD40 ZD42 ZD45 ZD47 ZD50 ZD51 ZD53
下桥驱动: C52 N129 N134 N192 N193 P28 P29 R164 R166 R170 R172 R173 R175 R176 R180 ZD46
RS触发器（或非门搭建）: C54 C56 D25-D31 D34 D35 D38-D40 D42 D43 H29-H31 H35-H37 N139-N145 N155 N158 N162 N164 N165 N171 N182 N?#26 N?#27 N?#30 R181-R184 R186 R188 R189 R203-R206 R219 R226 R231
非门: C?#1 D?#3-D?#7 H?#14 N?#22-N?#25 N?#28 N?#29 R?#22-R?#27
恒流源: COMP1 Q?? R185 R187 ZD54-ZD56
反馈基准电压（TL431）: C32 C35 COMP2 COMP3 N149-N151 N153 N154 N161 N166-N168 N180 N194 Q6 Q7 R191 R192 R202 R207 R208 R212-R215 R230 R234 ZD60 ZD62
1V: R190 R193 ZD57-ZD59
外置环路补偿: C?#2 R?#28